# Altium project a0206-2006.PrjPcb (part 1 of 5)
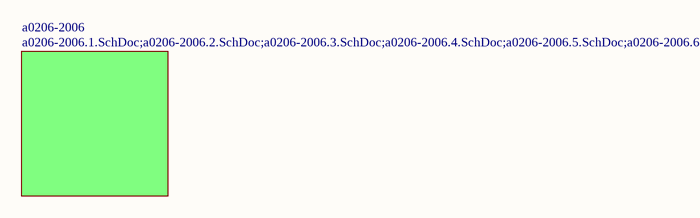
[diagram p0: a0206-2006.SchDoc]
19 sheets, 794 parts. Net scope: flat (ports and power ports of the same name join across sheets).
Sheets:
  a0206-2006.SchDoc
    a0206-2006 = a0206-2006.1.SchDoc
    a0206-2006 = a0206-2006.2.SchDoc
    a0206-2006 = a0206-2006.3.SchDoc
    a0206-2006 = a0206-2006.4.SchDoc
    a0206-2006 = a0206-2006.5.SchDoc
    a0206-2006 = a0206-2006.6.SchDoc
    a0206-2006 = a0206-2006.7.SchDoc
    a0206-2006 = a0206-2006.8.SchDoc
    a0206-2006 = a0206-2006.9.SchDoc
    a0206-2006 = a0206-2006.10.SchDoc
    a0206-2006 = a0206-2006.11.SchDoc
      MXVR265 = mxvr.1.SchDoc
    a0206-2006 = a0206-2006.12.SchDoc
    a0206-2006 = a0206-2006.13.SchDoc
    a0206-2006 = a0206-2006.14.SchDoc
    a0206-2006 = a0206-2006.15.SchDoc
    a0206-2006 = a0206-2006.16.SchDoc
    a0206-2006 = a0206-2006.17.SchDoc

## Sheet a0206-2006.SchDoc
size A

### Sub-sheets
a0206-2006 = a0206-2006.1.SchDoc;a0206-2006.2.SchDoc;a0206-2006.3.SchDoc;a0206-2006.4.SchDoc;a0206-2006.5.SchDoc;a0206-2006.6.SchDoc;a0206-2006.7.SchDoc;a0206-2006.8.SchDoc;a0206-2006.9.SchDoc;a0206-2006.10.SchDoc;a0206-2006.11.SchDoc;a0206-2006.12.SchDoc;a0206-2006.13.SchDoc;a0206-2006.14.SchDoc;a0206-2006.15.SchDoc;a0206-2006.16.SchDoc;a0206-2006.17.SchDoc: no entries

## Sheet a0206-2006.1.SchDoc
size 558 x 431 mm
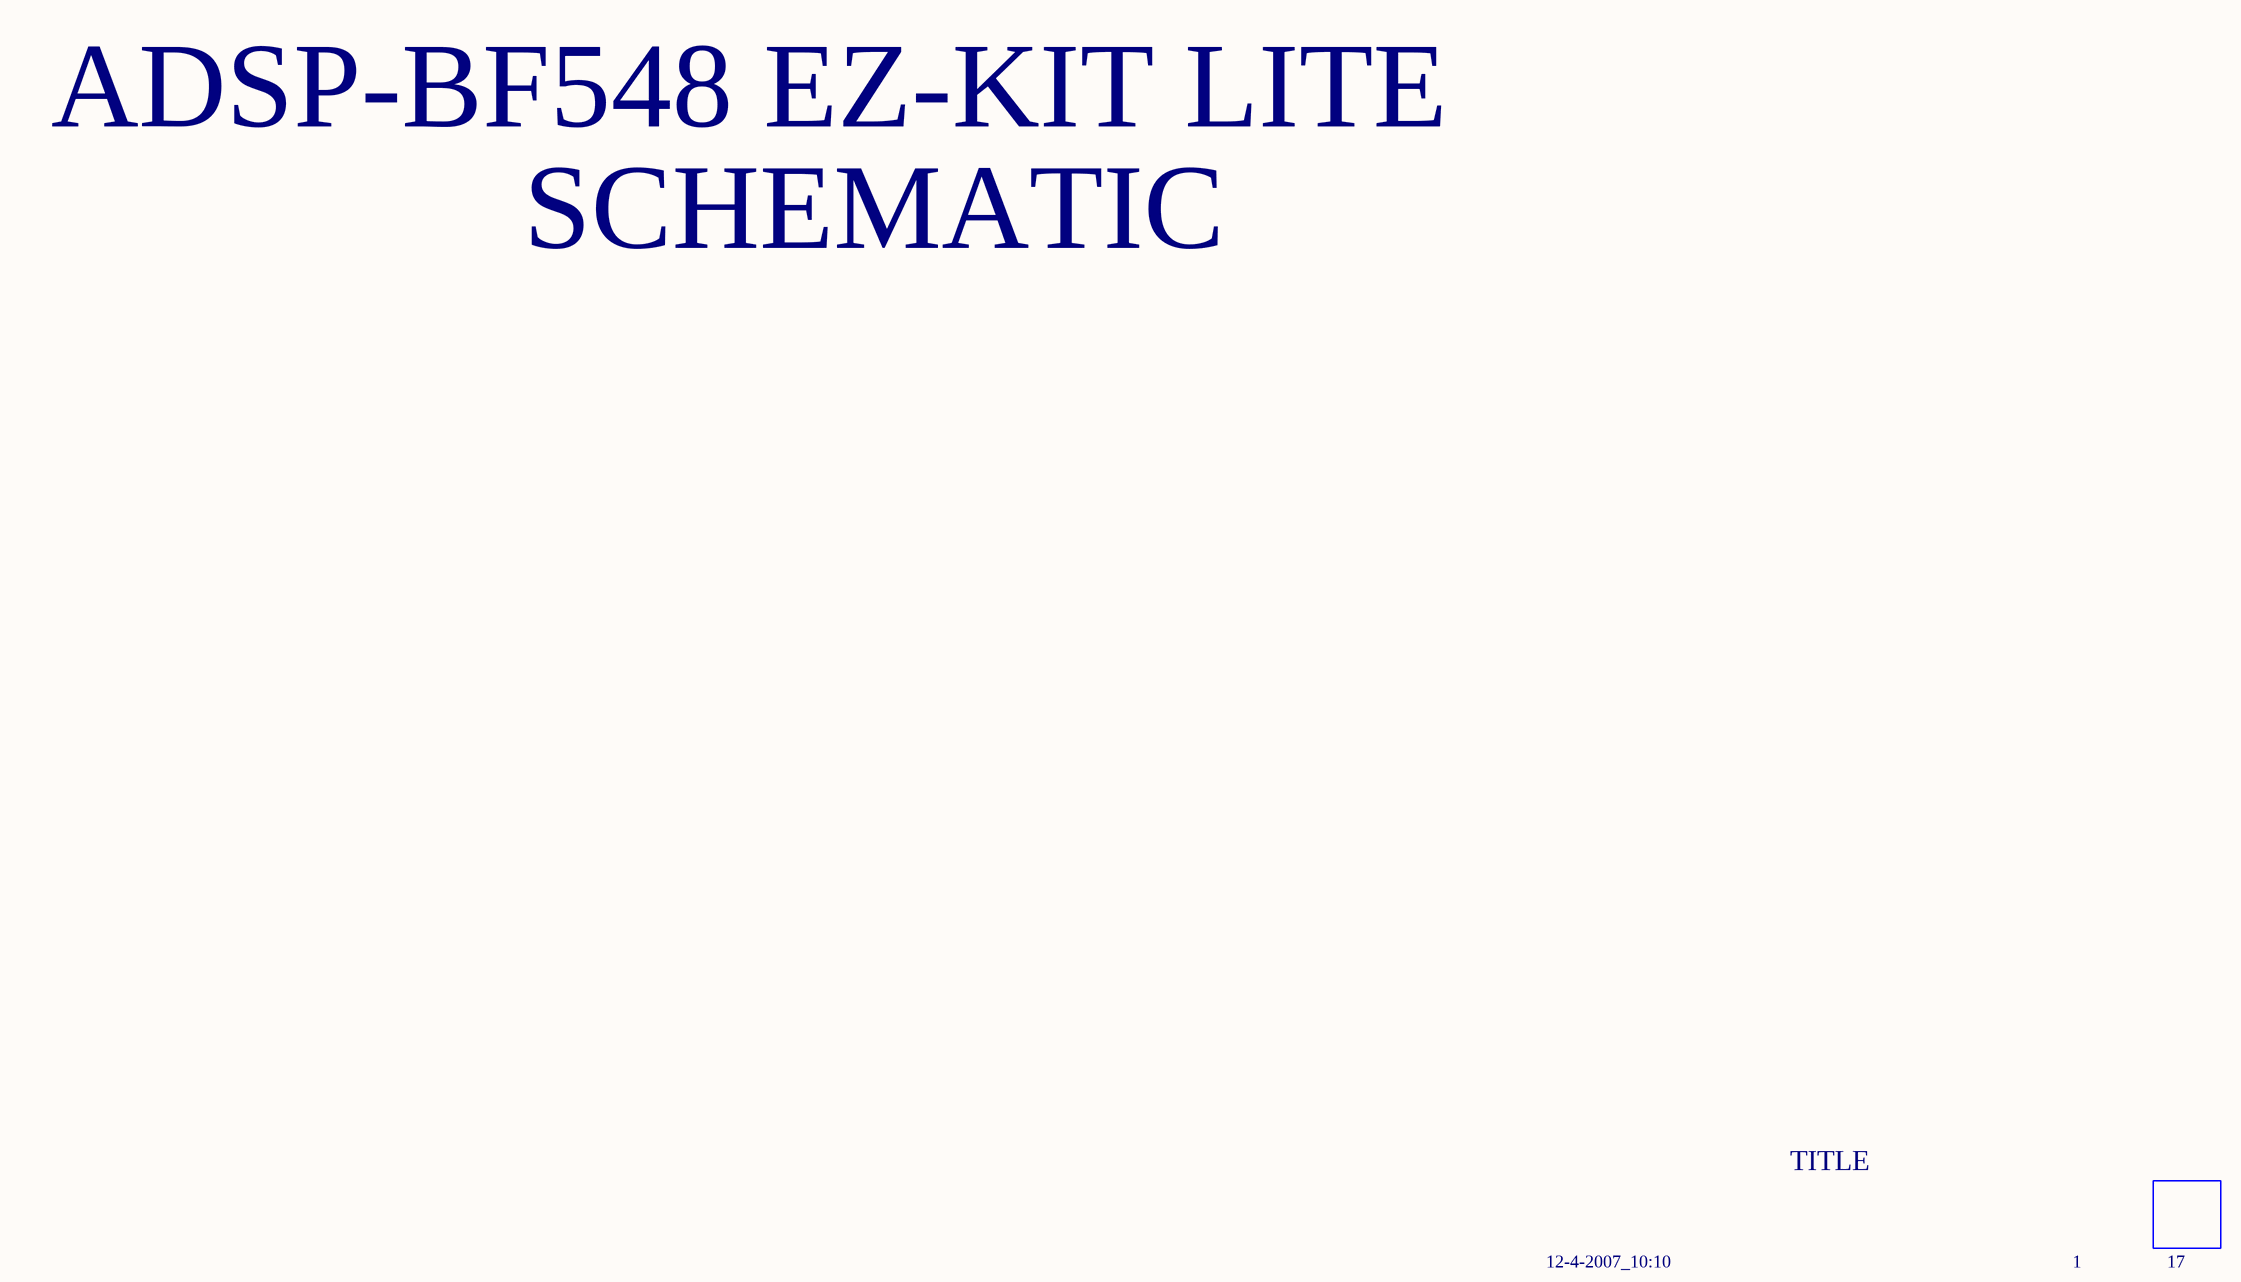
[diagram p1: a0206-2006.1.SchDoc]

### Parts
(Parts that share a designator on the sheet are numbered #1, #2 ... from top to bottom, then left to right.)
*#1  *  (value not drawn)

### Notes on the sheet
- ADSP-BF548 EZ-KIT LITE
- SCHEMATIC
- TITLE
- 12-4-2007_10:10
- (near *#1) 1
- (near *#1) 17
- A
- B
- C
- D
- 2
- 3
- 20 Cotton Road
- 4
- DEVICES
- ANALOG
- Nashua, NH 03063
- PH: 1-800-ANALOGD
- Title
- Size
- Board No.
- A0206-2006
- Rev
- 1.4B
- Date
- Sheet
- of

### Library data of the parts
*#1 = BD_REV.1: CLASS: DNP; LEVEL: BD_REV

## Sheet a0206-2006.2.SchDoc
size 558 x 431 mm
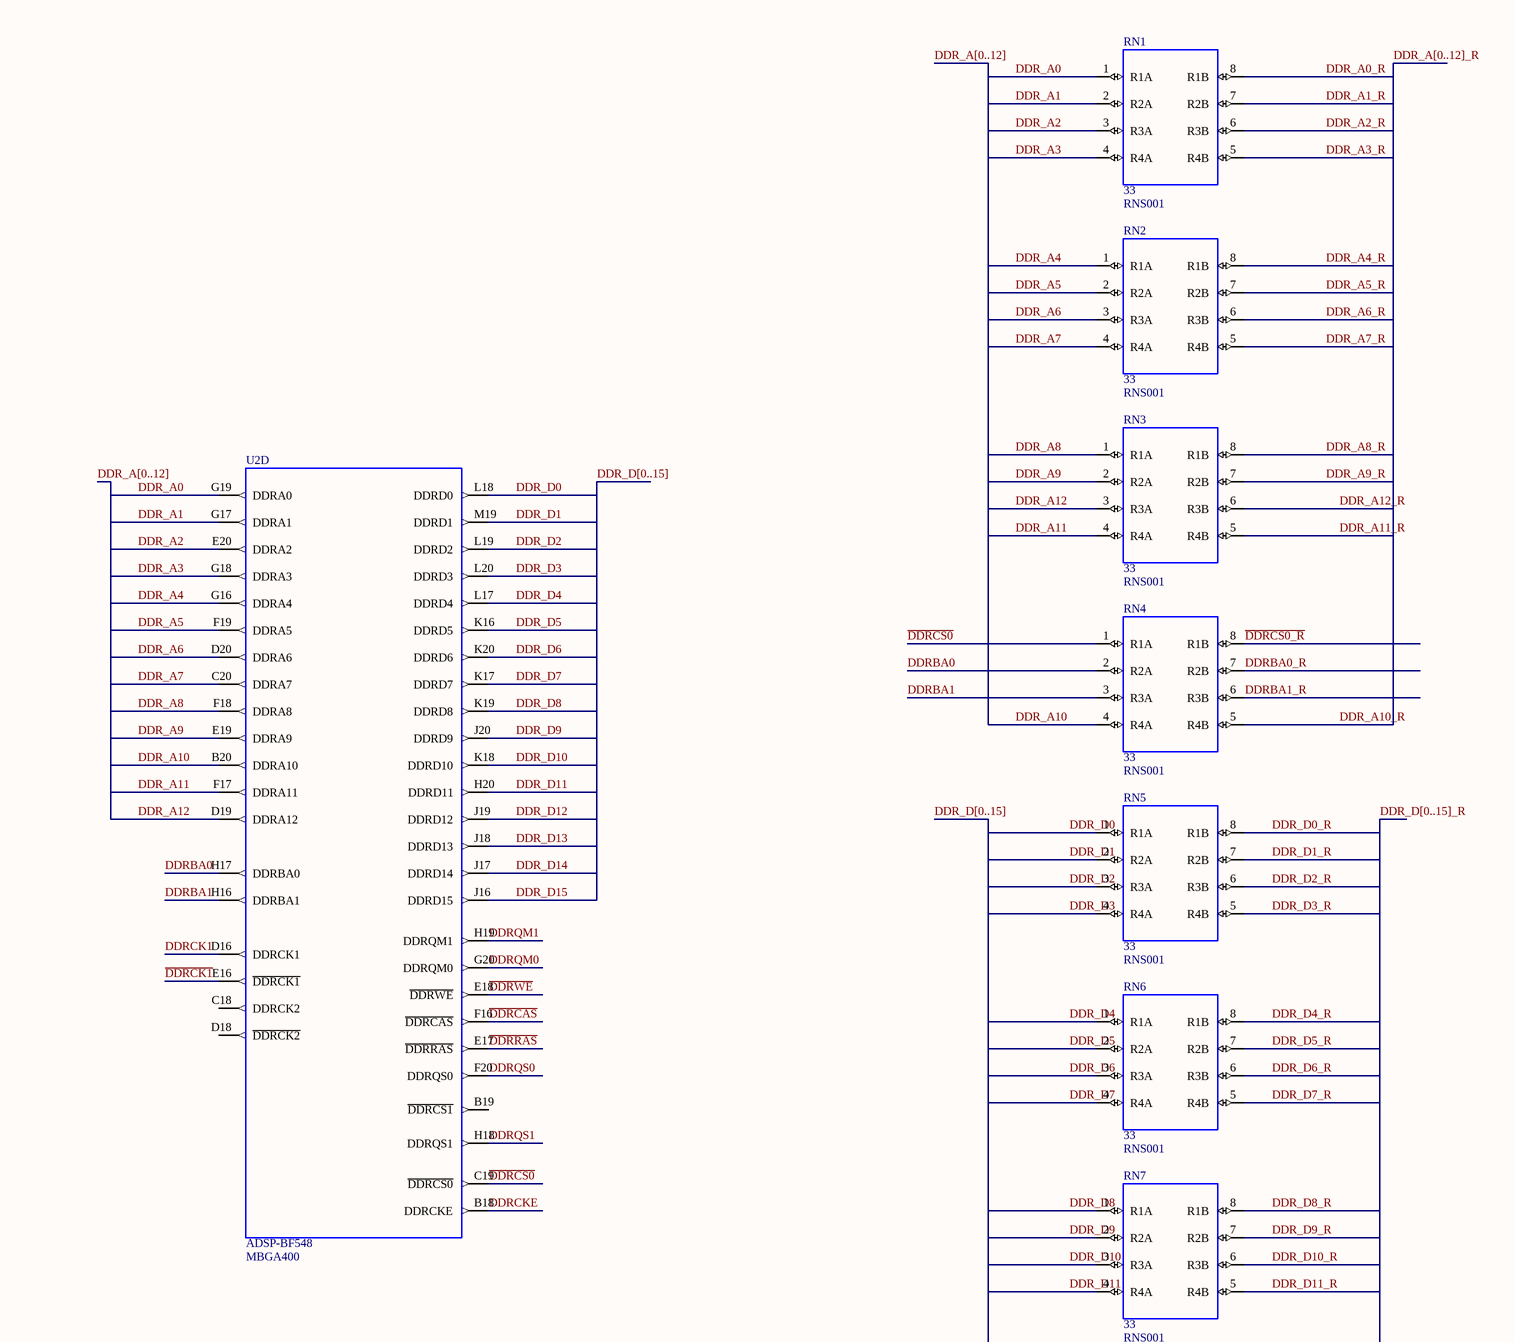
[diagram p2: a0206-2006.2.SchDoc, top left]
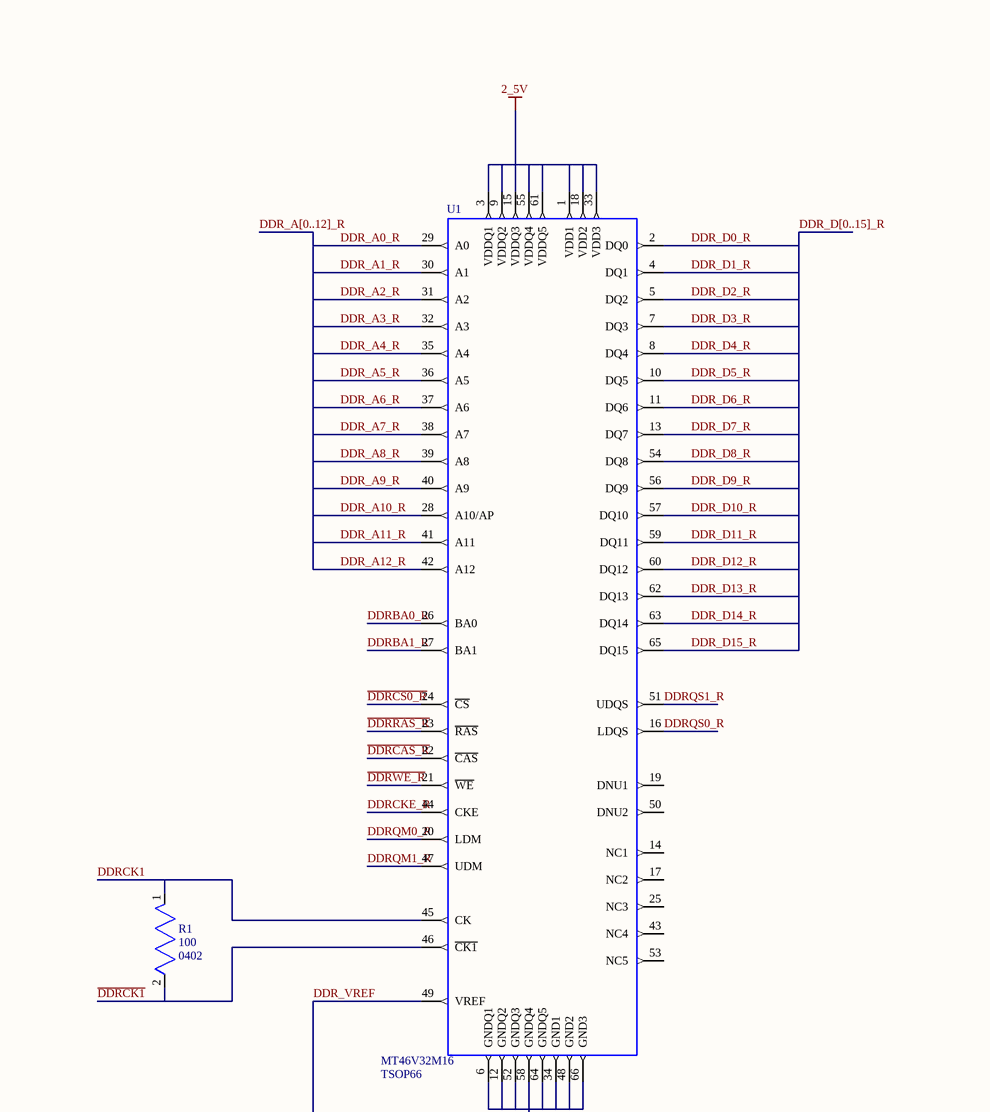
[diagram p3: a0206-2006.2.SchDoc, top right]
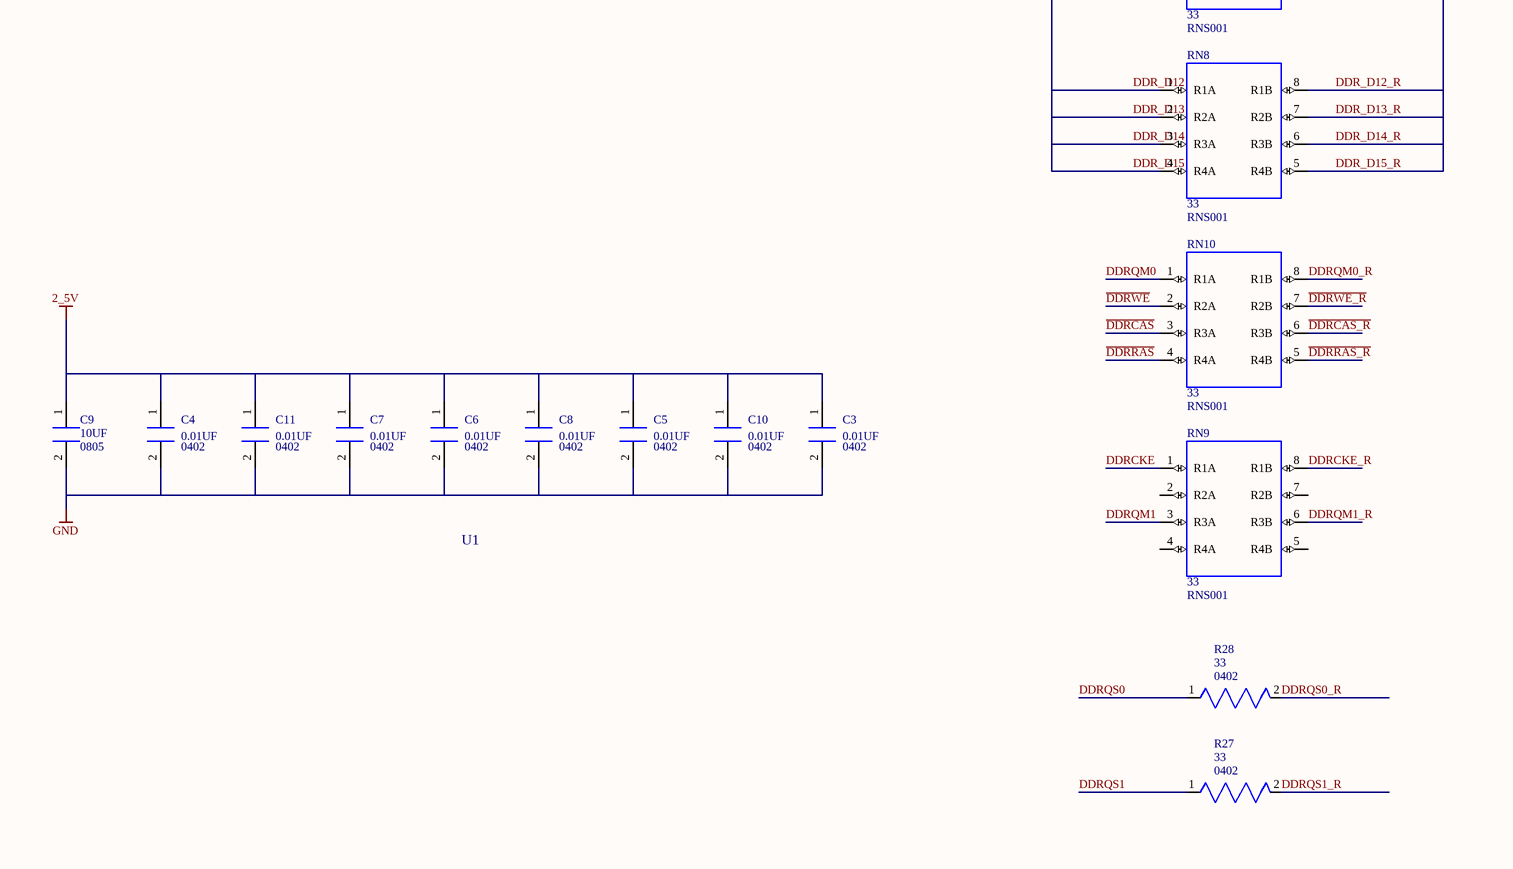
[diagram p4: a0206-2006.2.SchDoc, bottom left]
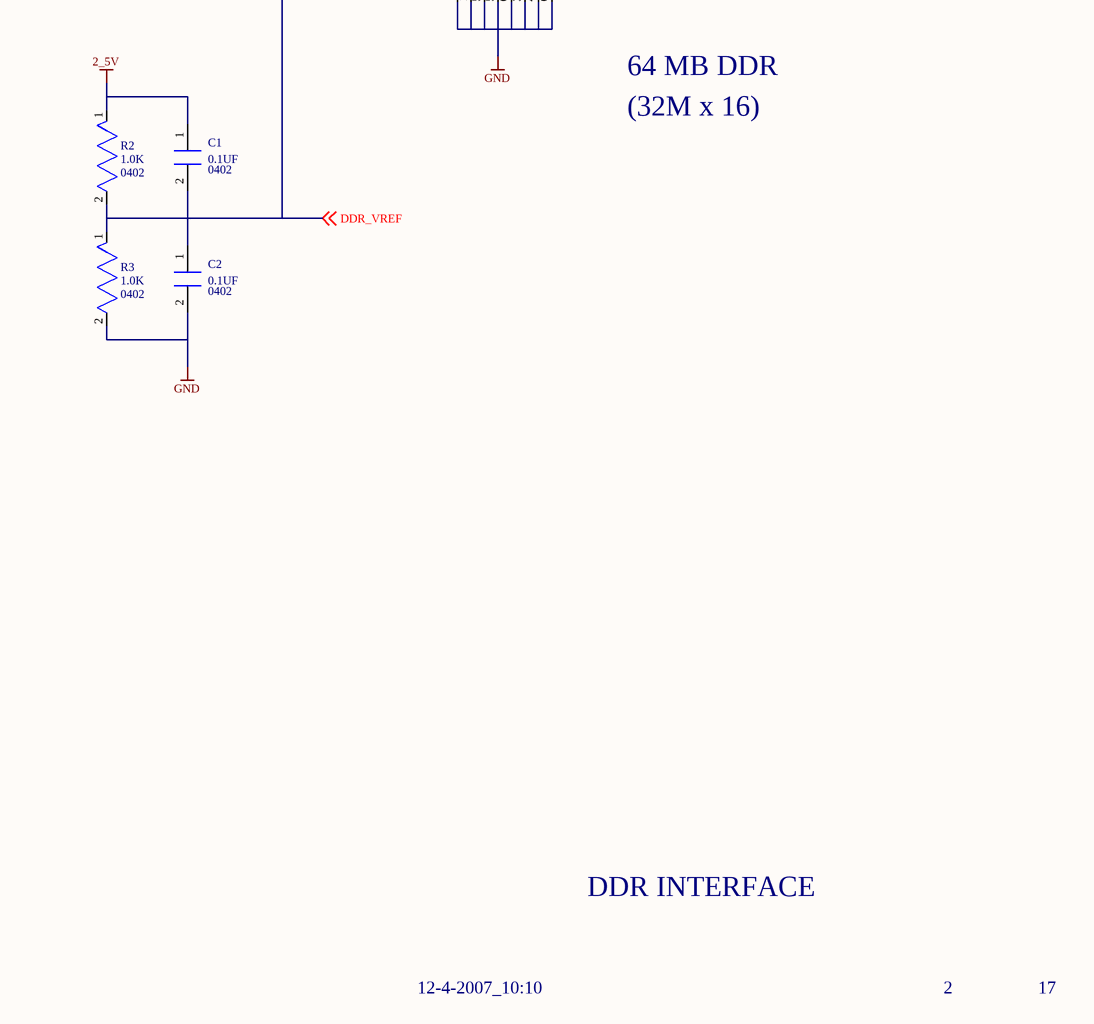
[diagram p5: a0206-2006.2.SchDoc, bottom right]

### Parts
C1  value 0.1UF  [0402]  (hidden comment: *)
C2  value 0.1UF  [0402]  (hidden comment: *)
C3  value 0.01UF  [0402]  (hidden comment: *)
C4  value 0.01UF  [0402]  (hidden comment: *)
C5  value 0.01UF  [0402]  (hidden comment: *)
C6  value 0.01UF  [0402]  (hidden comment: *)
C7  value 0.01UF  [0402]  (hidden comment: *)
C8  value 0.01UF  [0402]  (hidden comment: *)
C9  value 10UF  [0805]  (hidden comment: *)
C10  value 0.01UF  [0402]  (hidden comment: *)
C11  value 0.01UF  [0402]  (hidden comment: *)
R1  value 100  [0402]  (hidden comment: *)
R2  value 1.0K  [0402]  (hidden comment: *)
R3  value 1.0K  [0402]  (hidden comment: *)
R27  value 33  [0402]  (hidden comment: *)
R28  value 33  [0402]  (hidden comment: *)
RN1  value 33  [RNS001]  (hidden comment: *)
RN2  value 33  [RNS001]  (hidden comment: *)
RN3  value 33  [RNS001]  (hidden comment: *)
RN4  value 33  [RNS001]  (hidden comment: *)
RN5  value 33  [RNS001]  (hidden comment: *)
RN6  value 33  [RNS001]  (hidden comment: *)
RN7  value 33  [RNS001]  (hidden comment: *)
RN8  value 33  [RNS001]  (hidden comment: *)
RN9  value 33  [RNS001]  (hidden comment: *)
RN10  value 33  [RNS001]  (hidden comment: *)
U1  PART: MT46V32M16  [TSOP66]  (hidden comment: *)
U2  PART: ADSP-BF548  PKG_TYPE: MBGA400  (hidden comment: ICS_ADSPBF548)  (part D of 7)

### Nets
2_5V: C1.1(A) C3.1(A) C4.1(A) C5.1(A) C6.1(A) C7.1(A) C8.1(A) C9.1(A) C10.1(A) C11.1(A) R2.1(N1) U1.1(VDD1) U1.3(VDDQ1) U1.9(VDDQ2) U1.15(VDDQ3) U1.18(VDD2) U1.33(VDD3) U1.55(VDDQ4) U1.61(VDDQ5)
GND: C2.2(B) C3.2(B) C4.2(B) C5.2(B) C6.2(B) C7.2(B) C8.2(B) C9.2(B) C10.2(B) C11.2(B) R3.2(N2) U1.6(GNDQ1) U1.12(GNDQ2) U1.34(GND1) U1.48(GND2) U1.52(GNDQ3) U1.58(GNDQ4) U1.64(GNDQ5) U1.66(GND3)
~{DDRCAS}: RN10.3(R3A) U2.F16(~{DDRCAS})
~{DDRCAS_R}: RN10.6(R3B) U1.22(~{CAS})
~{DDRCK1}: R1.2(N2) U1.46(~{CK1}) U2.E16(~{DDRCK1})
~{DDRCS0}: RN4.1(R1A) U2.C19(~{DDRCS0})
~{DDRCS0_R}: RN4.8(R1B) U1.24(~{CS})
~{DDRRAS}: RN10.4(R4A) U2.E17(~{DDRRAS})
~{DDRRAS_R}: RN10.5(R4B) U1.23(~{RAS})
~{DDRWE}: RN10.2(R2A) U2.E18(~{DDRWE})
~{DDRWE_R}: RN10.7(R2B) U1.21(~{WE})
DDR_A0: RN1.1(R1A) U2.G19(DDRA0)
DDR_A0_R: RN1.8(R1B) U1.29(A0)
DDR_A1: RN1.2(R2A) U2.G17(DDRA1)
DDR_A1_R: RN1.7(R2B) U1.30(A1)
DDR_A2: RN1.3(R3A) U2.E20(DDRA2)
DDR_A2_R: RN1.6(R3B) U1.31(A2)
DDR_A3: RN1.4(R4A) U2.G18(DDRA3)
DDR_A3_R: RN1.5(R4B) U1.32(A3)
DDR_A4: RN2.1(R1A) U2.G16(DDRA4)
DDR_A4_R: RN2.8(R1B) U1.35(A4)
DDR_A5: RN2.2(R2A) U2.F19(DDRA5)
DDR_A5_R: RN2.7(R2B) U1.36(A5)
DDR_A6: RN2.3(R3A) U2.D20(DDRA6)
DDR_A6_R: RN2.6(R3B) U1.37(A6)
DDR_A7: RN2.4(R4A) U2.C20(DDRA7)
DDR_A7_R: RN2.5(R4B) U1.38(A7)
DDR_A8: RN3.1(R1A) U2.F18(DDRA8)
DDR_A8_R: RN3.8(R1B) U1.39(A8)
DDR_A9: RN3.2(R2A) U2.E19(DDRA9)
DDR_A9_R: RN3.7(R2B) U1.40(A9)
DDR_A10: RN4.4(R4A) U2.B20(DDRA10)
DDR_A10_R: RN4.5(R4B) U1.28(A10/AP)
DDR_A11: RN3.4(R4A) U2.F17(DDRA11)
DDR_A11_R: RN3.5(R4B) U1.41(A11)
DDR_A12: RN3.3(R3A) U2.D19(DDRA12)
DDR_A12_R: RN3.6(R3B) U1.42(A12)
DDR_D0: RN5.1(R1A) U2.L18(DDRD0)
DDR_D0_R: RN5.8(R1B) U1.2(DQ0)
DDR_D1: RN5.2(R2A) U2.M19(DDRD1)
DDR_D1_R: RN5.7(R2B) U1.4(DQ1)
DDR_D2: RN5.3(R3A) U2.L19(DDRD2)
DDR_D2_R: RN5.6(R3B) U1.5(DQ2)
DDR_D3: RN5.4(R4A) U2.L20(DDRD3)
DDR_D3_R: RN5.5(R4B) U1.7(DQ3)
DDR_D4: RN6.1(R1A) U2.L17(DDRD4)
DDR_D4_R: RN6.8(R1B) U1.8(DQ4)
DDR_D5: RN6.2(R2A) U2.K16(DDRD5)
DDR_D5_R: RN6.7(R2B) U1.10(DQ5)
DDR_D6: RN6.3(R3A) U2.K20(DDRD6)
DDR_D6_R: RN6.6(R3B) U1.11(DQ6)
DDR_D7: RN6.4(R4A) U2.K17(DDRD7)
DDR_D7_R: RN6.5(R4B) U1.13(DQ7)
DDR_D8: RN7.1(R1A) U2.K19(DDRD8)
DDR_D8_R: RN7.8(R1B) U1.54(DQ8)
DDR_D9: RN7.2(R2A) U2.J20(DDRD9)
DDR_D9_R: RN7.7(R2B) U1.56(DQ9)
DDR_D10: RN7.3(R3A) U2.K18(DDRD10)
DDR_D10_R: RN7.6(R3B) U1.57(DQ10)
DDR_D11: RN7.4(R4A) U2.H20(DDRD11)
DDR_D11_R: RN7.5(R4B) U1.59(DQ11)
DDR_D12: RN8.1(R1A) U2.J19(DDRD12)
DDR_D12_R: RN8.8(R1B) U1.60(DQ12)
DDR_D13: RN8.2(R2A) U2.J18(DDRD13)
DDR_D13_R: RN8.7(R2B) U1.62(DQ13)
DDR_D14: RN8.3(R3A) U2.J17(DDRD14)
DDR_D14_R: RN8.6(R3B) U1.63(DQ14)
DDR_D15: RN8.4(R4A) U2.J16(DDRD15)
DDR_D15_R: RN8.5(R4B) U1.65(DQ15)
DDR_VREF: C1.2(B) C2.1(A) R2.2(N2) R3.1(N1) U1.49(VREF) ; off-sheet DDR_VREF
DDRBA0: RN4.2(R2A) U2.H17(DDRBA0)
DDRBA0_R: RN4.7(R2B) U1.26(BA0)
DDRBA1: RN4.3(R3A) U2.H16(DDRBA1)
DDRBA1_R: RN4.6(R3B) U1.27(BA1)
DDRCK1: R1.1(N1) U1.45(CK) U2.D16(DDRCK1)
DDRCKE: RN9.1(R1A) U2.B18(DDRCKE)
DDRCKE_R: RN9.8(R1B) U1.44(CKE)
DDRQM0: RN10.1(R1A) U2.G20(DDRQM0)
DDRQM0_R: RN10.8(R1B) U1.20(LDM)
DDRQM1: RN9.3(R3A) U2.H19(DDRQM1)
DDRQM1_R: RN9.6(R3B) U1.47(UDM)
DDRQS0: R28.1(N1) U2.F20(DDRQS0)
DDRQS0_R: R28.2(N2) U1.16(LDQS)
DDRQS1: R27.1(N1) U2.H18(DDRQS1)
DDRQS1_R: R27.2(N2) U1.51(UDQS)

Not connected (* = marked no-connect by the designer): RN9 2(R2A) 4(R4A) 5(R4B) 7(R2B); U1 14(NC1) 17(NC2) 19(DNU1) 25(NC3) 43(NC4) 50(DNU2) 53(NC5); U2 B19(~{DDRCS1}) C18(DDRCK2) D18(~{DDRCK2})

### Buses and harness runs
bus DDR_A[0..12]
bus DDR_A[0..12]_R
bus DDR_D[0..15]
bus DDR_D[0..15]_R

### Notes on the sheet
- 64 MB DDR
- (32M x 16)
- U1
- DDR INTERFACE
- 12-4-2007_10:10
- 2
- 17
- A
- B
- C
- D
- 1
- 3
- 20 Cotton Road
- 4
- DEVICES
- ANALOG
- Nashua, NH 03063
- PH: 1-800-ANALOGD
- Title
- ADSP-BF548 EZ-KIT LITE
- Size
- Board No.
- A0206-2006
- Rev
- 1.4B
- Date
- Sheet
- of

### Library data of the parts
C1 = CAP_NON_POLARIZED.2: PART_SPEC: CAPACITOR; LEVEL: STD; TOLERANCE: 10%; VOLTAGE: 10V; TYPE: X5R; PRT_NUM: 7000278; PKG_TYPE: 0402; ROHS: ROHS
C2 = CAP_NON_POLARIZED.2: PART_SPEC: CAPACITOR; LEVEL: STD; PRT_NUM: 7000278; TYPE: X5R; VOLTAGE: 10V; TOLERANCE: 10%; PKG_TYPE: 0402; ROHS: ROHS
C3 C4 = CAP_NON_POLARIZED.2: PART_SPEC: CAPACITOR; LEVEL: STD; PRT_NUM: 7000279; VOLTAGE: 16V; TOLERANCE: 10%; BOARDS: BOTH; TYPE: X7R; PKG_TYPE: 0402; ROHS: ROHS
C5 C6 = CAP_NON_POLARIZED.2: PART_SPEC: CAPACITOR; LEVEL: STD; TYPE: X7R; BOARDS: BOTH; PRT_NUM: 7000279; VOLTAGE: 16V; TOLERANCE: 10%; PKG_TYPE: 0402; ROHS: ROHS
C7 C8 C10 C11 = CAP_NON_POLARIZED.2: PART_SPEC: CAPACITOR; LEVEL: STD; TYPE: X7R; BOARDS: BOTH; TOLERANCE: 10%; VOLTAGE: 16V; PRT_NUM: 7000279; PKG_TYPE: 0402; ROHS: ROHS
C9 = CAP_NON_POLARIZED.2: PART_SPEC: CAPACITOR; LEVEL: STD; TYPE: X5R; PRT_NUM: 7000265; VOLTAGE: 6.3V; TOLERANCE: 10%; BOARDS: BOTH; PKG_TYPE: 0805; ROHS: ROHS
R1 = RES_STANDARD.2: PART_SPEC: RESISTOR; LEVEL: STD; BOARDS: BOTH; PRT_NUM: 7000432; TOLERANCE: 5%; POWER: 1/16W; PKG_TYPE: 0402; ROHS: ROHS
R2 = RES_STANDARD.2: PART_SPEC: RESISTOR; LEVEL: STD; PRT_NUM: 7000571; TOLERANCE: 1%; POWER: 1/16W; PKG_TYPE: 0402; ROHS: ROHS
R3 = RES_STANDARD.2: PART_SPEC: RESISTOR; LEVEL: STD; PRT_NUM: 7000571; POWER: 1/16W; TOLERANCE: 1%; PKG_TYPE: 0402; ROHS: ROHS
R27 = RES_STANDARD.1: PART_SPEC: RESISTOR; LEVEL: STD; PRT_NUM: 7000285; POWER: 1/16W; TOLERANCE: 5%; PKG_TYPE: 0402; ROHS: ROHS
R28 = RES_STANDARD.1: PART_SPEC: RESISTOR; LEVEL: STD; TOLERANCE: 5%; POWER: 1/16W; PRT_NUM: 7000285; PKG_TYPE: 0402; ROHS: ROHS
RN1 RN3 RN6 RN8 RN10 = RNET_4SERIES.1: SERIES; PART_SPEC: RESISTOR_NETWORK; LEVEL: STD; PRT_NUM: 7000558; TOLERANCE: 5%; POWER: 125MW; PKG_TYPE: RNS001; ROHS: ROHS
RN2 RN4 RN5 RN7 RN9 = RNET_4SERIES.1: SERIES; PART_SPEC: RESISTOR_NETWORK; LEVEL: STD; PRT_NUM: 7000558; POWER: 125MW; TOLERANCE: 5%; PKG_TYPE: RNS001; ROHS: ROHS
U1 = ICS_MT46V32M16.1: 8MX16X4 DDR SDRAM; LEVEL: STD; PRT_NUM: 1000423; PKG_TYPE: TSOP66; WEB: http://www.micron.com/products/partdetail?part; ROHS: ROHS
U2 = ICS_ADSPBF548_A: 600 MHZ; LEVEL: STD; PRT_NUM: 30-025548-02; DEVICE: ICS_ADSPBF548; ROHS: ROHS; WEB: http://www.analog.com/en/prod/0,2877,ADSP%252DBF548,00.html

## Sheet a0206-2006.3.SchDoc
size 558 x 431 mm
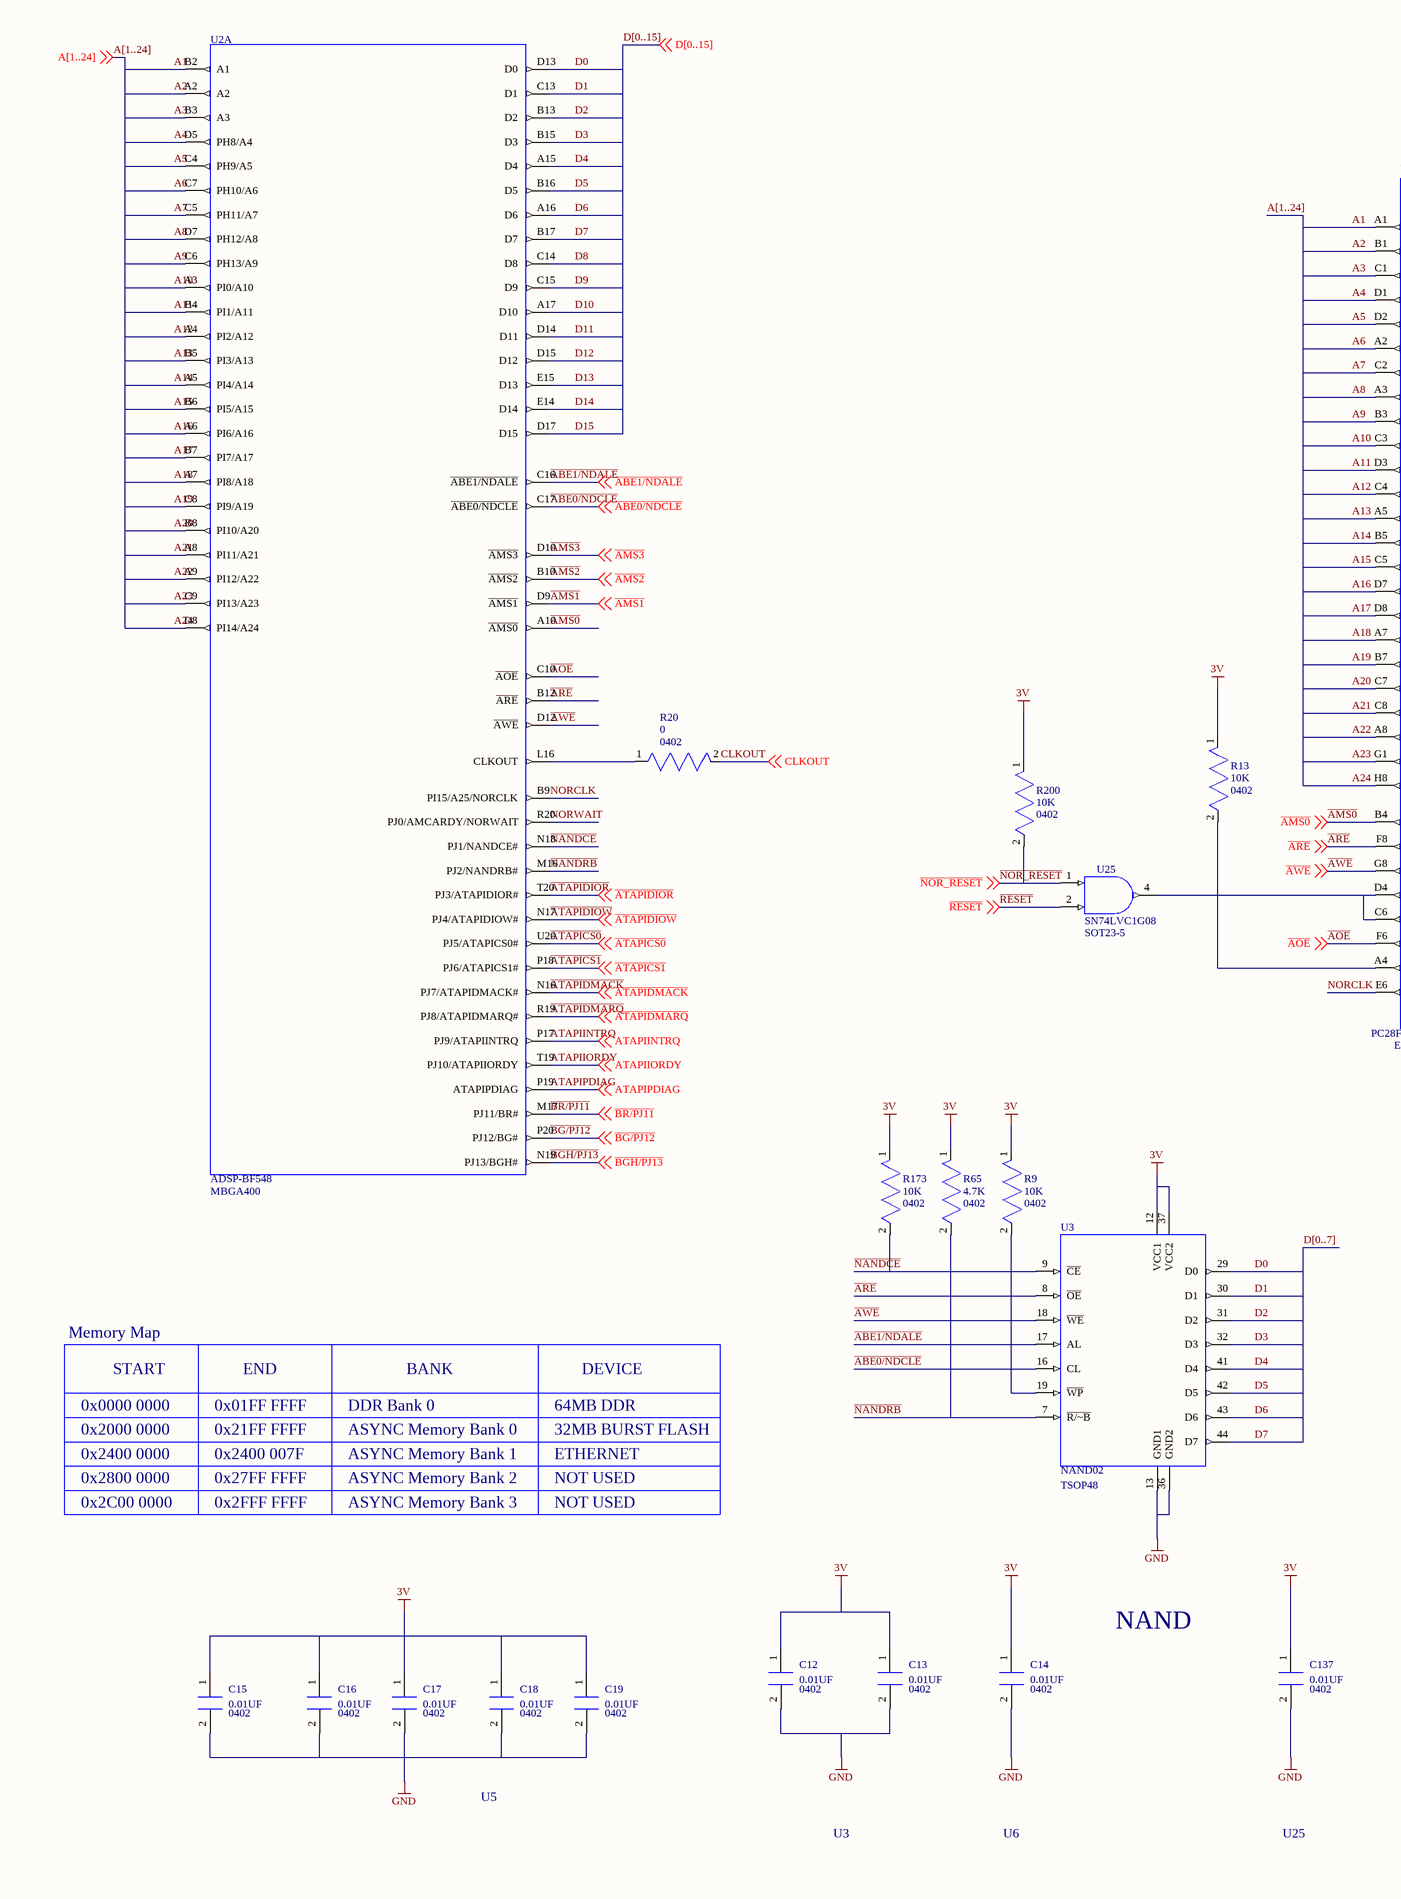
[diagram p6: a0206-2006.3.SchDoc, left]
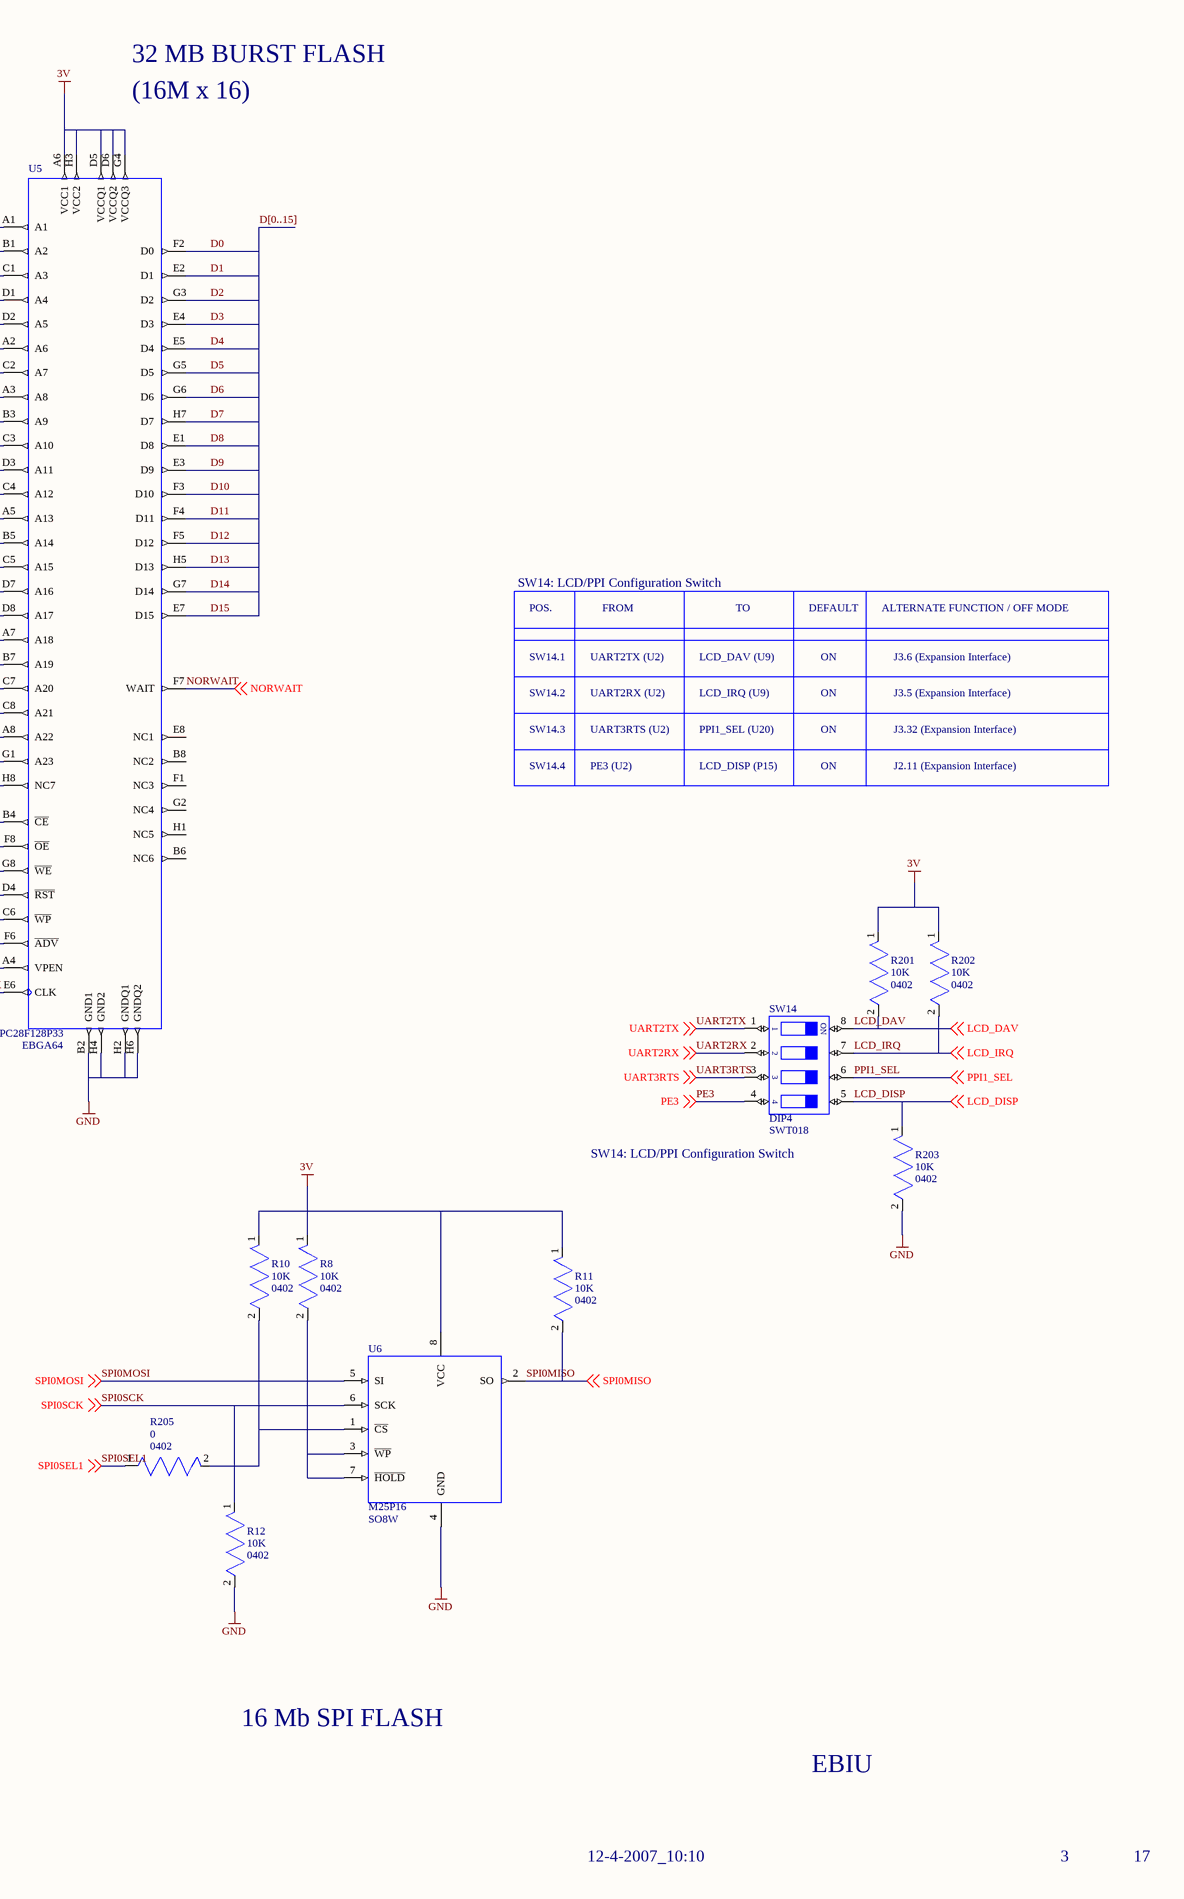
[diagram p7: a0206-2006.3.SchDoc, right]

### Parts
C12  value 0.01UF  [0402]  (hidden comment: *)
C13  value 0.01UF  [0402]  (hidden comment: *)
C14  value 0.01UF  [0402]  (hidden comment: *)
C15  value 0.01UF  [0402]  (hidden comment: *)
C16  value 0.01UF  [0402]  (hidden comment: *)
C17  value 0.01UF  [0402]  (hidden comment: *)
C18  value 0.01UF  [0402]  (hidden comment: *)
C19  value 0.01UF  [0402]  (hidden comment: *)
C137  value 0.01UF  [0402]  (hidden comment: *)
R8  value 10K  [0402]  (hidden comment: *)
R9  value 10K  [0402]  (hidden comment: *)
R10  value 10K  [0402]  (hidden comment: *)
R11  value 10K  [0402]  (hidden comment: *)
R12  value 10K  [0402]  (hidden comment: *)
R13  value 10K  [0402]  (hidden comment: *)
R20  value 0  [0402]  (hidden comment: *)
R65  value 4.7K  [0402]  (hidden comment: *)
R173  value 10K  [0402]  (hidden comment: *)
R200  value 10K  [0402]  (hidden comment: *)
R201  value 10K  [0402]  (hidden comment: *)
R202  value 10K  [0402]  (hidden comment: *)
R203  value 10K  [0402]  (hidden comment: *)
R205  value 0  [0402]  (hidden comment: *)
SW14  value DIP4  [SWT018]  (hidden comment: *)
U2  PART: ADSP-BF548  PKG_TYPE: MBGA400  (hidden comment: ICS_ADSPBF548)  (part A of 7)
U3  PART: NAND02  [TSOP48]  (hidden comment: *)
U5  PART: PC28F128P33  [EBGA64]  (hidden comment: *)
U6  PART: M25P16  [SO8W]  (hidden comment: *)
U25  PART: SN74LVC1G08  [SOT23-5]  (hidden comment: *)

### Nets
3V: C12.1(A) C13.1(A) C14.1(A) C15.1(A) C16.1(A) C17.1(A) C18.1(A) C19.1(A) C137.1(A) R8.1(N1) R9.1(N1) R10.1(N1) R11.1(N1) R13.1(N1) R65.1(N1) R173.1(N1) R200.1(N1) R201.1(N1) R202.1(N1) U3.12(VCC1) U3.37(VCC2) U5.A6(VCC1) U5.D5(VCCQ1) U5.D6(VCCQ2) U5.G4(VCCQ3) U5.H3(VCC2) U6.8(VCC) U25.5(3V)
GND: C12.2(B) C13.2(B) C14.2(B) C15.2(B) C16.2(B) C17.2(B) C18.2(B) C19.2(B) C137.2(B) R12.2(N2) R203.2(N2) U3.13(GND1) U3.36(GND2) U5.B2(GND1) U5.H2(GNDQ1) U5.H4(GND2) U5.H6(GNDQ2) U6.4(GND) U25.3(GND)
A1: U2.B2(A1) U5.A1
A2: U2.A2 U5.B1(A2)
A3: U2.B3(A3) U5.C1(A3)
A4: U2.D5(PH8/A4) U5.D1(A4)
A5: U2.C4(PH9/A5) U5.D2(A5)
A6: U2.C7(PH10/A6) U5.A2(A6)
A7: U2.C5(PH11/A7) U5.C2(A7)
A8: U2.D7(PH12/A8) U5.A3(A8)
A9: U2.C6(PH13/A9) U5.B3(A9)
A10: U2.A3(PI0/A10) U5.C3(A10)
A11: U2.B4(PI1/A11) U5.D3(A11)
A12: U2.A4(PI2/A12) U5.C4(A12)
A13: U2.B5(PI3/A13) U5.A5(A13)
A14: U2.A5(PI4/A14) U5.B5(A14)
A15: U2.B6(PI5/A15) U5.C5(A15)
A16: U2.A6(PI6/A16) U5.D7(A16)
A17: U2.B7(PI7/A17) U5.D8(A17)
A18: U2.A7(PI8/A18) U5.A7(A18)
A19: U2.C8(PI9/A19) U5.B7(A19)
A20: U2.B8(PI10/A20) U5.C7(A20)
A21: U2.A8(PI11/A21) U5.C8(A21)
A22: U2.A9(PI12/A22) U5.A8(A22)
A23: U2.C9(PI13/A23) U5.G1(A23)
A24: U2.D8(PI14/A24) U5.H8(NC7)
~{ABE0/NDCLE}: U2.C17(~{ABE0/NDCLE}) U3.16(CL) ; off-sheet ~{ABE0/NDCLE}
~{ABE1/NDALE}: U2.C16(~{ABE1/NDALE}) U3.17(AL) ; off-sheet ~{ABE1/NDALE}
~{AMS0}: U2.A10(~{AMS0}) U5.B4(~{CE}) ; off-sheet ~{AMS0}
~{AMS1}: U2.D9(~{AMS1}) ; off-sheet ~{AMS1}
~{AMS2}: U2.B10(~{AMS2}) ; off-sheet ~{AMS2}
~{AMS3}: U2.D10(~{AMS3}) ; off-sheet ~{AMS3}
~{AOE}: U2.C10(~{AOE}) U5.F6(~{ADV}) ; off-sheet ~{AOE}
~{ARE}: U2.B12(~{ARE}) U3.8(~{OE}) U5.F8(~{OE}) ; off-sheet ~{ARE}
~{ATAPICS0}: U2.U20(PJ5/ATAPICS0#) ; off-sheet ~{ATAPICS0}
~{ATAPICS1}: U2.P18(PJ6/ATAPICS1#) ; off-sheet ~{ATAPICS1}
~{ATAPIDIOR}: U2.T20(PJ3/ATAPIDIOR#) ; off-sheet ~{ATAPIDIOR}
~{ATAPIDIOW}: U2.N17(PJ4/ATAPIDIOW#) ; off-sheet ~{ATAPIDIOW}
~{ATAPIDMACK}: U2.N16(PJ7/ATAPIDMACK#) ; off-sheet ~{ATAPIDMACK}
~{ATAPIDMARQ}: U2.R19(PJ8/ATAPIDMARQ#) ; off-sheet ~{ATAPIDMARQ}
~{AWE}: U2.D12(~{AWE}) U3.18(~{WE}) U5.G8(~{WE}) ; off-sheet ~{AWE}
ATAPIINTRQ: U2.P17(PJ9/ATAPIINTRQ) ; off-sheet ATAPIINTRQ
ATAPIIORDY: U2.T19(PJ10/ATAPIIORDY) ; off-sheet ATAPIIORDY
ATAPIPDIAG: U2.P19(ATAPIPDIAG) ; off-sheet ATAPIPDIAG
~{BG/PJ12}: U2.P20(PJ12/BG#) ; off-sheet ~{BG/PJ12}
~{BGH/PJ13}: U2.N19(PJ13/BGH#) ; off-sheet ~{BGH/PJ13}
~{BR/PJ11}: U2.M17(PJ11/BR#) ; off-sheet ~{BR/PJ11}
CLKOUT: R20.2(N2) ; off-sheet CLKOUT
D0: U2.D13(D0) U3.29(D0) U5.F2(D0)
D1: U2.C13(D1) U3.30(D1) U5.E2(D1)
D2: U2.B13(D2) U3.31(D2) U5.G3(D2)
D3: U2.B15(D3) U3.32(D3) U5.E4(D3)
D4: U2.A15(D4) U3.41(D4) U5.E5(D4)
D5: U2.B16(D5) U3.42(D5) U5.G5(D5)
D6: U2.A16(D6) U3.43(D6) U5.G6(D6)
D7: U2.B17(D7) U3.44(D7) U5.H7(D7)
D8: U2.C14(D8) U5.E1(D8)
D9: U2.C15(D9) U5.E3(D9)
D10: U2.A17(D10) U5.F3(D10)
D11: U2.D14(D11) U5.F4(D11)
D12: U2.D15(D12) U5.F5(D12)
D13: U2.E15(D13) U5.H5(D13)
D14: U2.E14(D14) U5.G7(D14)
D15: U2.D17(D15) U5.E7(D15)
LCD_DAV: R201.2(N2) SW14.8 ; off-sheet LCD_DAV
LCD_DISP: R203.1(N1) SW14.5 ; off-sheet LCD_DISP
LCD_IRQ: R202.2(N2) SW14.7 ; off-sheet LCD_IRQ
~{NANDCE}: R173.2(N2) U2.N18(PJ1/NANDCE#) U3.9(~{CE})
~{NANDRB}: R65.2(N2) U2.M16(PJ2/NANDRB#) U3.7(~{R/~B})
~{NOR_RESET}: R200.2(N2) U25.1(A) ; off-sheet ~{NOR_RESET}
NORCLK: U2.B9(PI15/A25/NORCLK) U5.E6(CLK)
NORWAIT: U2.R20(PJ0/AMCARDY/NORWAIT) U5.F7(WAIT) ; off-sheet NORWAIT
PE3: SW14.4 ; off-sheet PE3
PPI1_SEL: SW14.6 ; off-sheet PPI1_SEL
~{RESET}: U25.2(B) ; off-sheet ~{RESET}
SPI0MISO: R11.2(N2) U6.2(SO) ; off-sheet SPI0MISO
SPI0MOSI: U6.5(SI) ; off-sheet SPI0MOSI
SPI0SCK: R12.1(N1) U6.6(SCK) ; off-sheet SPI0SCK
SPI0SEL1: R205.1(N1) ; off-sheet SPI0SEL1
UART2RX: SW14.2 ; off-sheet UART2RX
UART2TX: SW14.1 ; off-sheet UART2TX
UART3RTS: SW14.3 ; off-sheet UART3RTS
NetR8_2: R8.2(N2) U6.3(~{WP}) U6.7(~{HOLD})
NetR9_2: R9.2(N2) U3.19(~{WP})
NetR10_2: R10.2(N2) R205.2(N2) U6.1(~{CS})
NetR13_2: R13.2(N2) U5.A4(VPEN)
NetR20_1: R20.1(N1) U2.L16(CLKOUT)
NetU5_C6: U5.C6(~{WP}) U5.D4(~{RST}) U25.4(Y)

Not connected (* = marked no-connect by the designer): U3 1 2 3 4 5 6 10 11 14 15 20 21 22 23 24 25 26 27 28 33 34 35 38 39 40 45 46 47 48; U5 B6(NC6) B8(NC2) E8(NC1) F1(NC3) G2(NC4) H1(NC5)

### Buses and harness runs
bus A[1..24]
bus D[0..7]
bus D[0..15]

### Notes on the sheet
- (16M x 16)
- 32 MB BURST FLASH
- SW14: LCD/PPI Configuration Switch
- SW14.1
- POS.
- UART2TX (U2)
- FROM
- LCD_DAV (U9)
- TO
- DEFAULT
- ON
- ALTERNATE FUNCTION / OFF MODE
- J3.6 (Expansion Interface)
- SW14.2
- UART2RX (U2)
- LCD_IRQ (U9)
- J3.5 (Expansion Interface)
- SW14.3
- SW14.4
- PE3 (U2)
- UART3RTS (U2)
- PPI1_SEL (U20)
- LCD_DISP (P15)
- J2.11 (Expansion Interface)
- J3.32 (Expansion Interface)
- (near SW14) SW14: LCD/PPI Configuration Switch
- Memory Map
- START
- END
- BANK
- DEVICE
- 0x0000 0000
- 0x2000 0000
- 0x2400 0000
- 0x01FF FFFF
- 0x21FF FFFF
- 0x2400 007F
- ASYNC Memory Bank 0
- ASYNC Memory Bank 1
- DDR Bank 0
- 64MB DDR
- 32MB BURST FLASH
- ETHERNET
- 0x2800 0000
- 0x2C00 0000
- 0x27FF FFFF
- 0x2FFF FFFF
- ASYNC Memory Bank 2
- ASYNC Memory Bank 3
- NOT USED
- NAND
- 16 Mb SPI FLASH
- U5
- EBIU
- U3
- U6
- U25
- 12-4-2007_10:10
- 3
- 17
- A
- B
- C
- D
- 1
- 2
- 20 Cotton Road
- 4
- DEVICES
- ANALOG
- Nashua, NH 03063
- PH: 1-800-ANALOGD
- Title
- ADSP-BF548 EZ-KIT LITE
- Size
- Board No.
- A0206-2006
- Rev
- 1.4B
- Date
- Sheet
- of
- (in symbol SW_DIP4.1) ON

### Library data of the parts
C12 C14 C16 C18 = CAP_NON_POLARIZED.2: as C5 on sheet a0206-2006.2; PKG_TYPE: 0402; ROHS: ROHS
C13 C15 C17 C19 C137 = CAP_NON_POLARIZED.2: PART_SPEC: CAPACITOR; LEVEL: STD; TOLERANCE: 10%; VOLTAGE: 16V; PRT_NUM: 7000279; BOARDS: BOTH; TYPE: X7R; PKG_TYPE: 0402; ROHS: ROHS
R8 R12 R200 R201 = RES_STANDARD.2: PART_SPEC: RESISTOR; LEVEL: STD; PRT_NUM: 7000280; TOLERANCE: 5%; BOARDS: BOTH; POWER: 1/16W; PKG_TYPE: 0402; ROHS: ROHS
R9-R11 R13 R173 R202 R203 = RES_STANDARD.2: PART_SPEC: RESISTOR; LEVEL: STD; POWER: 1/16W; BOARDS: BOTH; TOLERANCE: 5%; PRT_NUM: 7000280; PKG_TYPE: 0402; ROHS: ROHS
R20 = RES_STANDARD.1: PART_SPEC: RESISTOR; LEVEL: STD; PRT_NUM: 7000282; POWER: 1/16W; TOLERANCE: 5%; PKG_TYPE: 0402; ROHS: ROHS
R65 = RES_STANDARD.2: PART_SPEC: RESISTOR; LEVEL: STD; PRT_NUM: 7000281; TOLERANCE: 5%; BOARDS: BOTH; POWER: 1/16W; PKG_TYPE: 0402; ROHS: ROHS
R205 = RES_STANDARD.1: PART_SPEC: RESISTOR; LEVEL: STD; TOLERANCE: 5%; POWER: 1/16W; PRT_NUM: 7000282; PKG_TYPE: 0402; ROHS: ROHS
SW14 = SW_DIP4.1: PART_SPEC: SWITCH; LEVEL: STD; PRT_NUM: 6000144; PKG_TYPE: SWT018; ROHS: ROHS
U2 = ICS_ADSPBF548_A: as U2 on sheet a0206-2006.2; DEVICE: ICS_ADSPBF548; ROHS: ROHS; WEB: http://www.analog.com/en/prod/0,2877,ADSP%252DBF548,00.html
U3 = ICS_NAND02.1: 2GBIT_NAND_FLASH; NC: 1,2,3,4,5,6,10,11,14,15,20,21,22,23,24,25,26,27,28,33,34,35,38,39,40,45,46,47,48; LEVEL: STD; PRT_NUM: 1000354; PKG_TYPE: TSOP48; ROHS: ROHS; WEB: http://www.st.com/stonline/stappl/productcatalog/app?path
U5 = PRG_PC28F128P33.1: 16MX16-FLASH; ICS_BASE_PART: 1000424; LEVEL: STD; BD_REFDES: "U5"; BOARD: BF548; PRT_NUM: 1000427; PKG_TYPE: EBGA64; WEB: http://www.intel.com/design/flcomp/datashts/314749.htm; ROHS: ROHS
U6 = PRG_M25P80.1: 16MBIT 3V SERIAL SPI ROM; ICS_BASE_PART: 1000418; LEVEL: STD; BOARD: BF548; BD_REFDES: “U6”; PRT_NUM: 1000445; PKG_TYPE: SO8W; WEB: http://www.st.com/stonline/products/literature/ds/10027/m25p16.htm; ROHS: ROHS
U25 = ICS_SN74XXX1G08.1: SINGLE 2-INPUT AND; LEVEL: STD; PRT_NUM: 1000287; BOARDS: BOTH; PKG_TYPE: SOT23-5; WEB: http://focus.ti.com/docs/prod/folders/print/sn74lvc1g08.html; ROHS: ROHS

## Sheet a0206-2006.4.SchDoc
size 558 x 431 mm
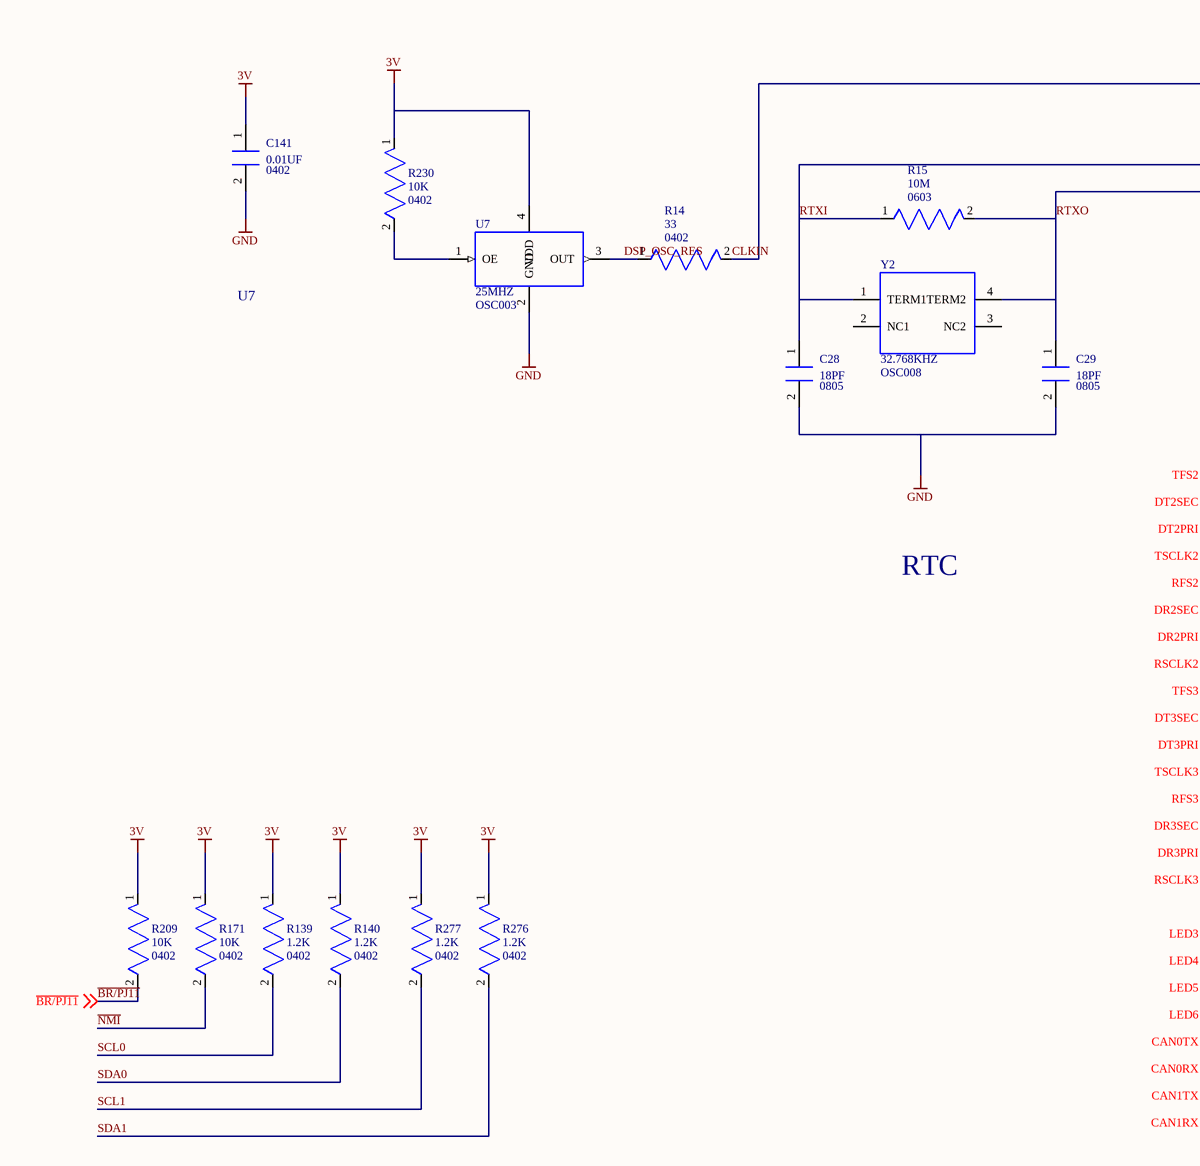
[diagram p8: a0206-2006.4.SchDoc, top left]
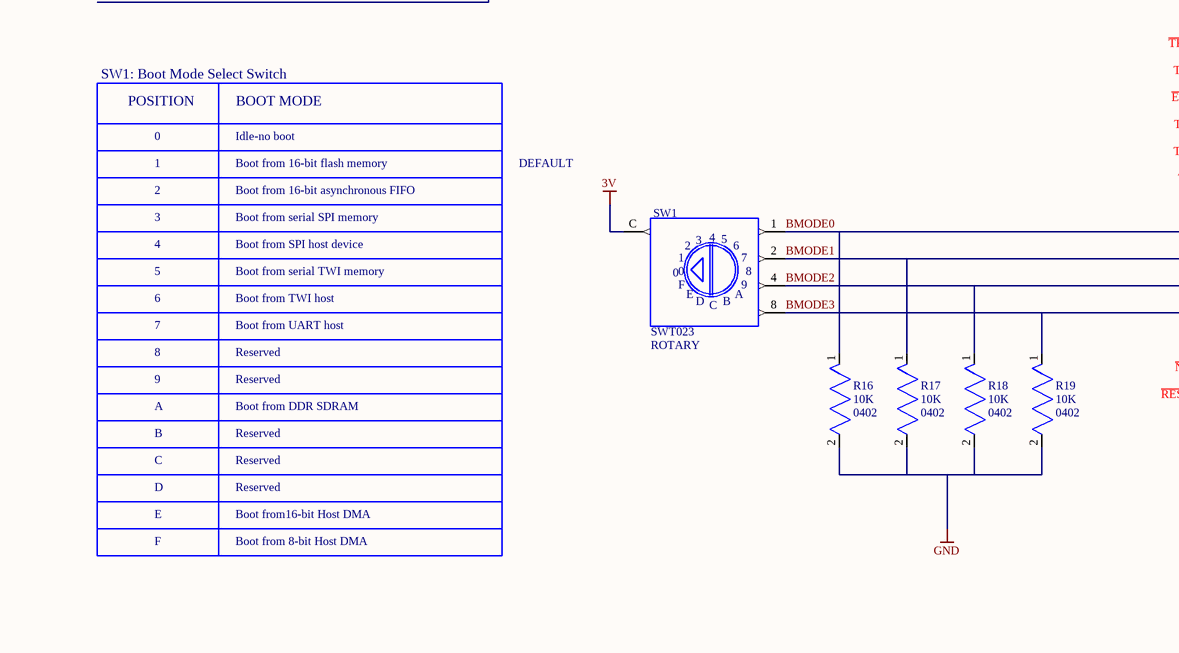
[diagram p9: a0206-2006.4.SchDoc, bottom left]
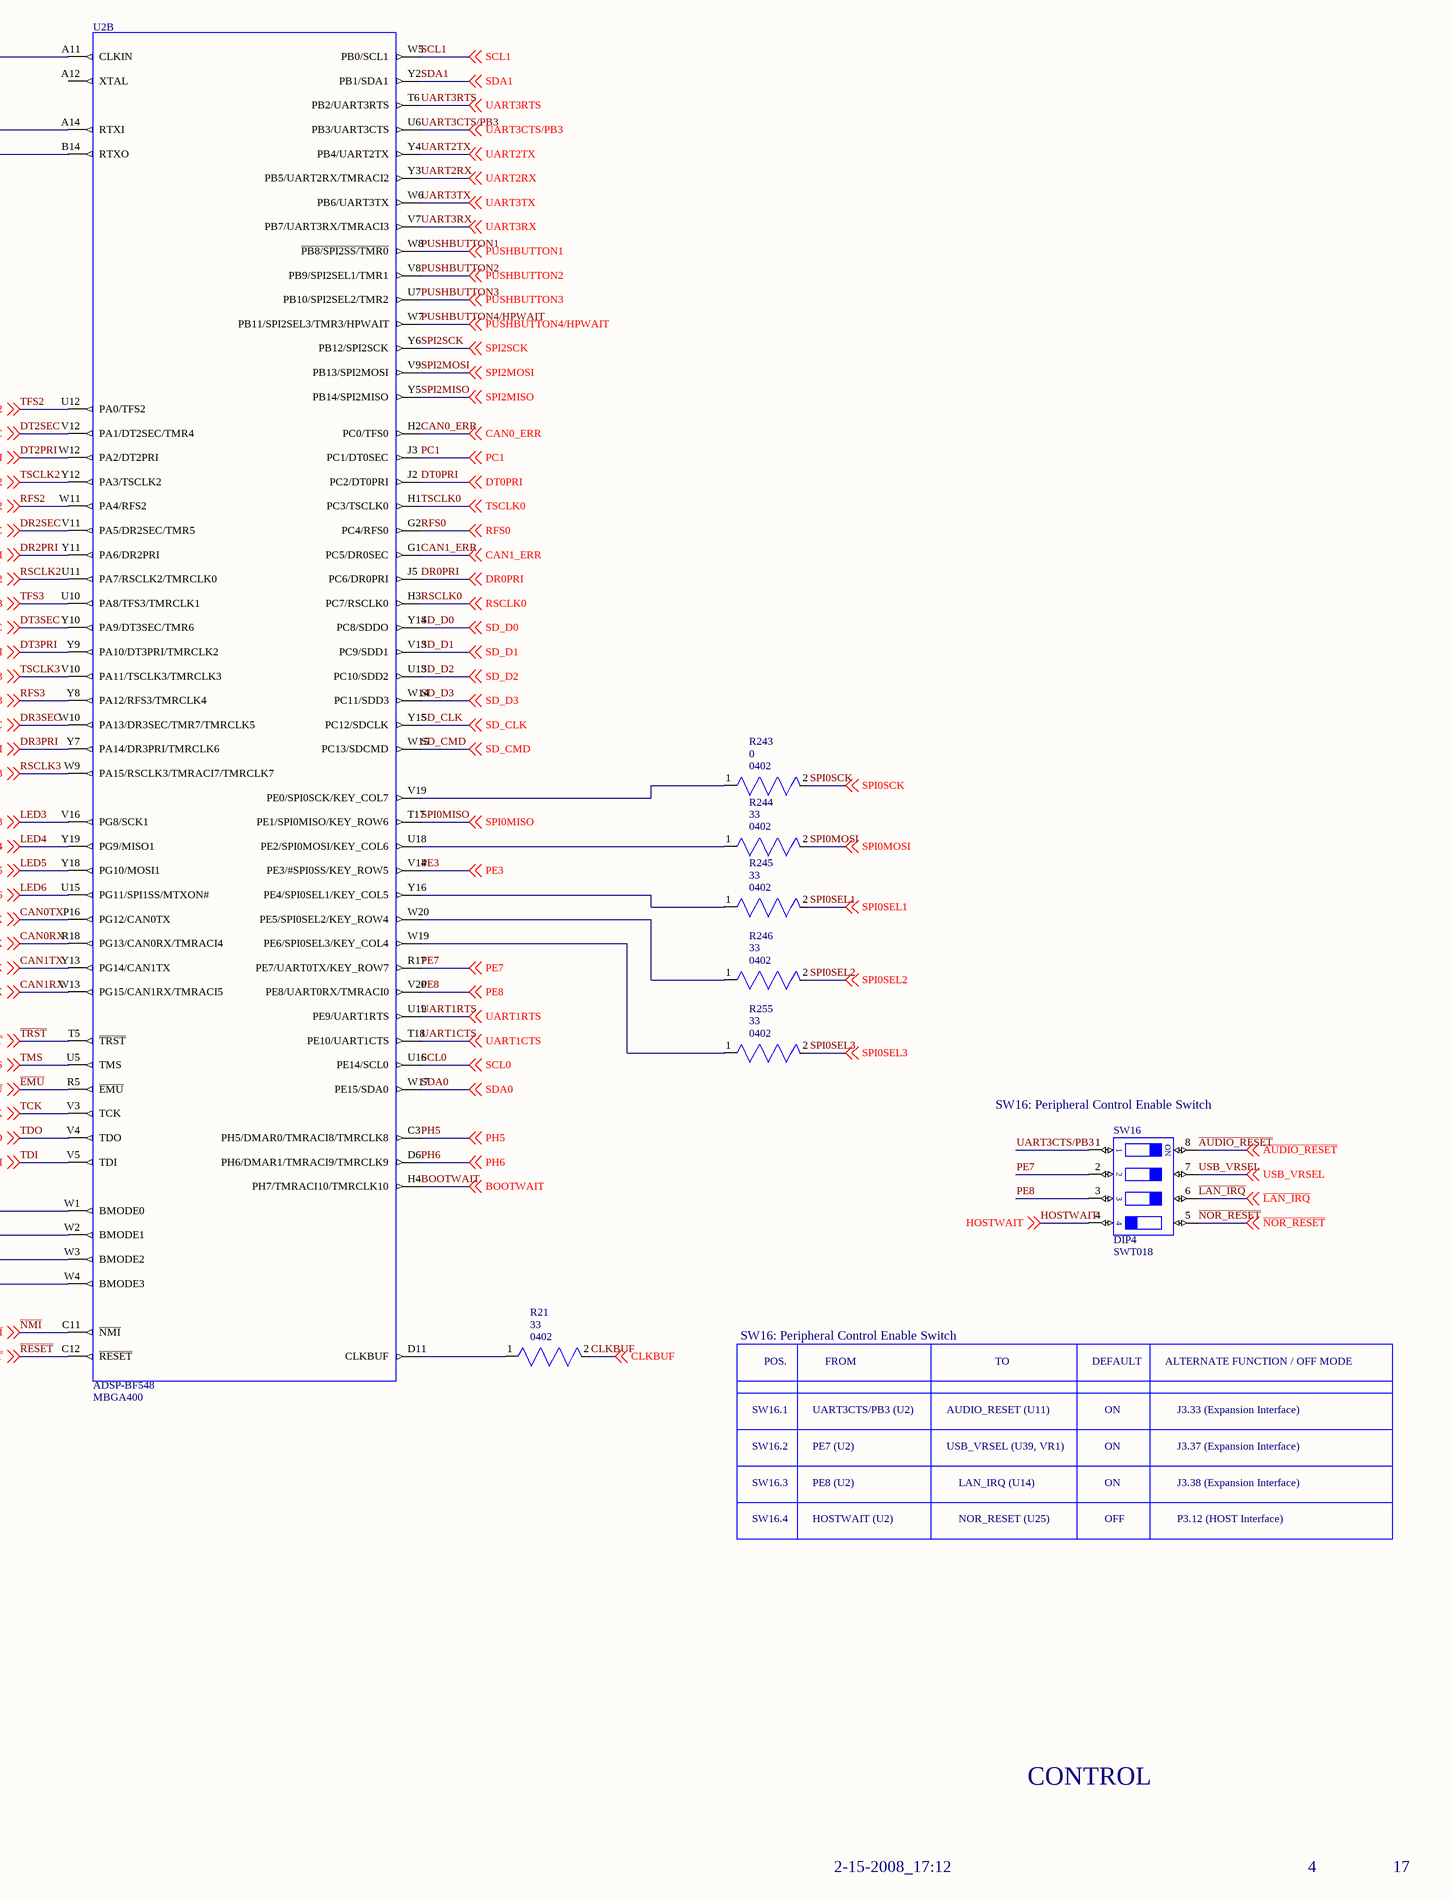
[diagram p10: a0206-2006.4.SchDoc, bottom right]

### Parts
C28  value 18PF  [0805]  (hidden comment: *)
C29  value 18PF  [0805]  (hidden comment: *)
C141  value 0.01UF  [0402]  (hidden comment: *)
R14  value 33  [0402]  (hidden comment: *)
R15  value 10M  [0603]  (hidden comment: *)
R16  value 10K  [0402]  (hidden comment: *)
R17  value 10K  [0402]  (hidden comment: *)
R18  value 10K  [0402]  (hidden comment: *)
R19  value 10K  [0402]  (hidden comment: *)
R21  value 33  [0402]  (hidden comment: *)
R139  value 1.2K  [0402]  (hidden comment: *)
R140  value 1.2K  [0402]  (hidden comment: *)
R171  value 10K  [0402]  (hidden comment: *)
R209  value 10K  [0402]  (hidden comment: *)
R230  value 10K  [0402]  (hidden comment: *)
R243  value 0  [0402]  (hidden comment: *)
R244  value 33  [0402]  (hidden comment: *)
R245  value 33  [0402]  (hidden comment: *)
R246  value 33  [0402]  (hidden comment: *)
R255  value 33  [0402]  (hidden comment: *)
R276  value 1.2K  [0402]  (hidden comment: *)
R277  value 1.2K  [0402]  (hidden comment: *)
SW1  value ROTARY  [SWT023]  (hidden comment: *)
SW16  value DIP4  [SWT018]  (hidden comment: *)
U2  PART: ADSP-BF548  PKG_TYPE: MBGA400  (hidden comment: ICS_ADSPBF548)  (part B of 7)
U7  value 25MHZ  [OSC003]  (hidden comment: *)
Y2  value 32.768KHZ  [OSC008]  (hidden comment: *)

### Nets
3V: C141.1(A) R139.1(N1) R140.1(N1) R171.1(N1) R209.1(N1) R230.1(N1) R276.1(N1) R277.1(N1) SW1.C U7.4(VDD)
GND: C28.2(B) C29.2(B) C141.2(B) R16.2(N2) R17.2(N2) R18.2(N2) R19.2(N2) U7.2(GND)
~{AUDIO_RESET}: SW16.8 ; off-sheet ~{AUDIO_RESET}
~{BR/PJ11}: R209.2(N2) ; off-sheet ~{BR/PJ11}
BMODE0: R16.1(N1) SW1.1(~{1}) U2.W1(BMODE0)
BMODE1: R17.1(N1) SW1.2(~{2}) U2.W2(BMODE1)
BMODE2: R18.1(N1) SW1.4(~{4}) U2.W3(BMODE2)
BMODE3: R19.1(N1) SW1.8(~{8}) U2.W4(BMODE3)
BOOTWAIT: U2.H4(PH7/TMRACI10/TMRCLK10) ; off-sheet BOOTWAIT
CAN0_ERR: U2.H2(PC0/TFS0) ; off-sheet CAN0_ERR
CAN0RX: U2.R18(PG13/CAN0RX/TMRACI4) ; off-sheet CAN0RX
CAN0TX: U2.P16(PG12/CAN0TX) ; off-sheet CAN0TX
CAN1_ERR: U2.G1(PC5/DR0SEC) ; off-sheet CAN1_ERR
CAN1RX: U2.W13(PG15/CAN1RX/TMRACI5) ; off-sheet CAN1RX
CAN1TX: U2.Y13(PG14/CAN1TX) ; off-sheet CAN1TX
CLKBUF: R21.2(N2) ; off-sheet CLKBUF
CLKIN: R14.2(N2) U2.A11(CLKIN)
DR0PRI: U2.J5(PC6/DR0PRI) ; off-sheet DR0PRI
DR2PRI: U2.Y11(PA6/DR2PRI) ; off-sheet DR2PRI
DR2SEC: U2.V11(PA5/DR2SEC/TMR5) ; off-sheet DR2SEC
DR3PRI: U2.Y7(PA14/DR3PRI/TMRCLK6) ; off-sheet DR3PRI
DR3SEC: U2.W10(PA13/DR3SEC/TMR7/TMRCLK5) ; off-sheet DR3SEC
DSP_OSC_RES: R14.1(N1) U7.3(OUT)
DT0PRI: U2.J2(PC2/DT0PRI) ; off-sheet DT0PRI
DT2PRI: U2.W12(PA2/DT2PRI) ; off-sheet DT2PRI
DT2SEC: U2.V12(PA1/DT2SEC/TMR4) ; off-sheet DT2SEC
DT3PRI: U2.Y9(PA10/DT3PRI/TMRCLK2) ; off-sheet DT3PRI
DT3SEC: U2.Y10(PA9/DT3SEC/TMR6) ; off-sheet DT3SEC
~{EMU}: U2.R5(~{EMU}) ; off-sheet ~{EMU}
HOSTWAIT: SW16.4 ; off-sheet HOSTWAIT
~{LAN_IRQ}: SW16.6 ; off-sheet ~{LAN_IRQ}
LED3: U2.V16(PG8/SCK1) ; off-sheet LED3
LED4: U2.Y19(PG9/MISO1) ; off-sheet LED4
LED5: U2.Y18(PG10/MOSI1) ; off-sheet LED5
LED6: U2.U15(PG11/SPI1SS/MTXON#) ; off-sheet LED6
~{NMI}: R171.2(N2) U2.C11(~{NMI}) ; off-sheet ~{NMI}
~{NOR_RESET}: SW16.5 ; off-sheet ~{NOR_RESET}
PC1: U2.J3(PC1/DT0SEC) ; off-sheet PC1
PE3: U2.V14(PE3/#SPI0SS/KEY_ROW5) ; off-sheet PE3
PE7: SW16.2 U2.R17(PE7/UART0TX/KEY_ROW7) ; off-sheet PE7
PE8: SW16.3 U2.V20(PE8/UART0RX/TMRACI0) ; off-sheet PE8
PH5: U2.C3(PH5/DMAR0/TMRACI8/TMRCLK8) ; off-sheet PH5
PH6: U2.D6(PH6/DMAR1/TMRACI9/TMRCLK9) ; off-sheet PH6
PUSHBUTTON1: U2.W8(~{PB8/SPI2SS/TMR0}) ; off-sheet PUSHBUTTON1
PUSHBUTTON2: U2.V8(PB9/SPI2SEL1/TMR1) ; off-sheet PUSHBUTTON2
PUSHBUTTON3: U2.U7(PB10/SPI2SEL2/TMR2) ; off-sheet PUSHBUTTON3
PUSHBUTTON4/HPWAIT: U2.W7(PB11/SPI2SEL3/TMR3/HPWAIT) ; off-sheet PUSHBUTTON4/HPWAIT
~{RESET}: U2.C12(~{RESET}) ; off-sheet ~{RESET}
RFS0: U2.G2(PC4/RFS0) ; off-sheet RFS0
RFS2: U2.W11(PA4/RFS2) ; off-sheet RFS2
RFS3: U2.Y8(PA12/RFS3/TMRCLK4) ; off-sheet RFS3
RSCLK0: U2.H3(PC7/RSCLK0) ; off-sheet RSCLK0
RSCLK2: U2.U11(PA7/RSCLK2/TMRCLK0) ; off-sheet RSCLK2
RSCLK3: U2.W9(PA15/RSCLK3/TMRACI7/TMRCLK7) ; off-sheet RSCLK3
RTXI: C28.1(A) R15.1(N1) U2.A14(RTXI) Y2.1(TERM1)
RTXO: C29.1(A) R15.2(N2) U2.B14(RTXO) Y2.4(TERM2)
SCL0: R139.2(N2) U2.U16(PE14/SCL0) ; off-sheet SCL0
SCL1: R277.2(N2) U2.W5(PB0/SCL1) ; off-sheet SCL1
SD_CLK: U2.Y15(PC12/SDCLK) ; off-sheet SD_CLK
SD_CMD: U2.W15(PC13/SDCMD) ; off-sheet SD_CMD
SD_D0: U2.Y14(PC8/SDDO) ; off-sheet SD_D0
SD_D1: U2.V13(PC9/SDD1) ; off-sheet SD_D1
SD_D2: U2.U13(PC10/SDD2) ; off-sheet SD_D2
SD_D3: U2.W14(PC11/SDD3) ; off-sheet SD_D3
SDA0: R140.2(N2) U2.W17(PE15/SDA0) ; off-sheet SDA0
SDA1: R276.2(N2) U2.Y2(PB1/SDA1) ; off-sheet SDA1
SPI0MISO: U2.T17(PE1/SPI0MISO/KEY_ROW6) ; off-sheet SPI0MISO
SPI0MOSI: R244.2(N2) ; off-sheet SPI0MOSI
SPI0SCK: R243.2(N2) ; off-sheet SPI0SCK
SPI0SEL1: R245.2(N2) ; off-sheet SPI0SEL1
SPI0SEL2: R246.2(N2) ; off-sheet SPI0SEL2
SPI0SEL3: R255.2(N2) ; off-sheet SPI0SEL3
SPI2MISO: U2.Y5(PB14/SPI2MISO) ; off-sheet SPI2MISO
SPI2MOSI: U2.V9(PB13/SPI2MOSI) ; off-sheet SPI2MOSI
SPI2SCK: U2.Y6(PB12/SPI2SCK) ; off-sheet SPI2SCK
~{TRST}: U2.T5(~{TRST}) ; off-sheet ~{TRST}
TCK: U2.V3(TCK) ; off-sheet TCK
TDI: U2.V5(TDI) ; off-sheet TDI
TDO: U2.V4(TDO) ; off-sheet TDO
TFS2: U2.U12(PA0/TFS2) ; off-sheet TFS2
TFS3: U2.U10(PA8/TFS3/TMRCLK1) ; off-sheet TFS3
TMS: U2.U5(TMS) ; off-sheet TMS
TSCLK0: U2.H1(PC3/TSCLK0) ; off-sheet TSCLK0
TSCLK2: U2.Y12(PA3/TSCLK2) ; off-sheet TSCLK2
TSCLK3: U2.V10(PA11/TSCLK3/TMRCLK3) ; off-sheet TSCLK3
UART1CTS: U2.T18(PE10/UART1CTS) ; off-sheet UART1CTS
UART1RTS: U2.U19(PE9/UART1RTS) ; off-sheet UART1RTS
UART2RX: U2.Y3(PB5/UART2RX/TMRACI2) ; off-sheet UART2RX
UART2TX: U2.Y4(PB4/UART2TX) ; off-sheet UART2TX
UART3CTS/PB3: SW16.1 U2.U6(PB3/UART3CTS) ; off-sheet UART3CTS/PB3
UART3RTS: U2.T6(PB2/UART3RTS) ; off-sheet UART3RTS
UART3RX: U2.V7(PB7/UART3RX/TMRACI3) ; off-sheet UART3RX
UART3TX: U2.W6(PB6/UART3TX) ; off-sheet UART3TX
USB_VRSEL: SW16.7 ; off-sheet USB_VRSEL
NetR21_1: R21.1(N1) U2.D11(CLKBUF)
NetR230_2: R230.2(N2) U7.1(OE)
NetR243_1: R243.1(N1) U2.V19(PE0/SPI0SCK/KEY_COL7)
NetR244_1: R244.1(N1) U2.U18(PE2/SPI0MOSI/KEY_COL6)
NetR245_1: R245.1(N1) U2.Y16(PE4/SPI0SEL1/KEY_COL5)
NetR246_1: R246.1(N1) U2.W20(PE5/SPI0SEL2/KEY_ROW4)
NetR255_1: R255.1(N1) U2.W19(PE6/SPI0SEL3/KEY_COL4)

Not connected (* = marked no-connect by the designer): SW1 3 5 6 7; U2 A12(XTAL); Y2 2(NC1) 3(NC2)

### Notes on the sheet
- U7
- RTC
- SW1: Boot Mode Select Switch
- POSITION
- BOOT MODE
- 1
- 0
- Idle-no boot
- Boot from 16-bit flash memory
- DEFAULT
- (near SW16) SW16: Peripheral Control Enable Switch
- 2
- 3
- 4
- Boot from 16-bit asynchronous FIFO
- Boot from serial SPI memory
- Boot from SPI host device
- 5
- 6
- Boot from serial TWI memory
- Boot from TWI host
- 7
- 8
- 9
- Reserved
- Boot from UART host
- SW16: Peripheral Control Enable Switch
- A
- B
- Boot from DDR SDRAM
- POS.
- FROM
- TO
- ALTERNATE FUNCTION / OFF MODE
- C
- D
- E
- Boot from16-bit Host DMA
- SW16.1
- SW16.2
- UART3CTS/PB3 (U2)
- PE7 (U2)
- AUDIO_RESET (U11)
- USB_VRSEL (U39, VR1)
- ON
- J3.33 (Expansion Interface)
- J3.37 (Expansion Interface)
- F
- Boot from 8-bit Host DMA
- SW16.3
- SW16.4
- PE8 (U2)
- HOSTWAIT (U2)
- LAN_IRQ (U14)
- NOR_RESET (U25)
- OFF
- J3.38 (Expansion Interface)
- P3.12 (HOST Interface)
- CONTROL
- 2-15-2008_17:12
- 17
- 20 Cotton Road
- DEVICES
- ANALOG
- Nashua, NH 03063
- PH: 1-800-ANALOGD
- Title
- ADSP-BF548 EZ-KIT LITE
- Size
- Board No.
- A0206-2006
- Rev
- 1.4B
- Date
- Sheet
- of
- (in symbol SW_DIP4.1) ON
- (in symbol SW_ROTARY_4.1) 0; F; 9; E; A; D; B

### Library data of the parts
C28 = CAP_NON_POLARIZED.2: PART_SPEC: CAPACITOR; LEVEL: STD; TYPE: NPO; BOARDS: BOTH; PRT_NUM: 7000287; TOLERANCE: 5%; VOLTAGE: 50V; PKG_TYPE: 0805; ROHS: ROHS
C29 = CAP_NON_POLARIZED.2: PART_SPEC: CAPACITOR; LEVEL: STD; TYPE: NPO; BOARDS: BOTH; PRT_NUM: 7000287; VOLTAGE: 50V; TOLERANCE: 5%; PKG_TYPE: 0805; ROHS: ROHS
C141 = CAP_NON_POLARIZED.2: as C7 on sheet a0206-2006.2; PKG_TYPE: 0402; ROHS: ROHS
R14 R21 = RES_STANDARD.1: PART_SPEC: RESISTOR; LEVEL: STD; POWER: 1/16W; BOARDS: BOTH; TOLERANCE: 5%; PRT_NUM: 7000285; PKG_TYPE: 0402; ROHS: ROHS
R15 = RES_STANDARD.1: PART_SPEC: RESISTOR; LEVEL: STD; POWER: 1/10W; PRT_NUM: 7000366; BOARDS: BOTH; TOLERANCE: 5%; PKG_TYPE: 0603; ROHS: ROHS
R16 R18 = RES_STANDARD.2: as R8 on sheet a0206-2006.3; PKG_TYPE: 0402; ROHS: ROHS
R17 R19 R230 = RES_STANDARD.2: as R9 on sheet a0206-2006.3; PKG_TYPE: 0402; ROHS: ROHS
R139 R276 = RES_STANDARD.2: PART_SPEC: RESISTOR; LEVEL: STD; BOARDS: BOTH; PRT_NUM: 7000283; TOLERANCE: 5%; POWER: 1/16W; PKG_TYPE: 0402; ROHS: ROHS
R140 R277 = RES_STANDARD.2: PART_SPEC: RESISTOR; LEVEL: STD; POWER: 1/16W; TOLERANCE: 5%; PRT_NUM: 7000283; BOARDS: BOTH; PKG_TYPE: 0402; ROHS: ROHS
R171 = RES_STANDARD.2: PART_SPEC: RESISTOR; LEVEL: STD; POWER: 1/16W; TOLERANCE: 5%; PRT_NUM: 7000280; BOARDS: BOTH; PKG_TYPE: 0402; ROHS: ROHS
R209 = RES_STANDARD.2: PART_SPEC: RESISTOR; LEVEL: STD; BOARDS: BOTH; PRT_NUM: 7000280; TOLERANCE: 5%; POWER: 1/16W; PKG_TYPE: 0402; ROHS: ROHS
R243 = RES_STANDARD.1: as R20 on sheet a0206-2006.3; PKG_TYPE: 0402; ROHS: ROHS
R244 R246 = RES_STANDARD.1: as R28 on sheet a0206-2006.2; PKG_TYPE: 0402; ROHS: ROHS
R245 R255 = RES_STANDARD.1: as R27 on sheet a0206-2006.2; PKG_TYPE: 0402; ROHS: ROHS
SW1 = SW_ROTARY_4.1: NC: 3,5,6,7; LEVEL: STD; PRT_NUM: 6000822; PKG_TYPE: SWT023; ROHS: ROHS
SW16 = SW_DIP4.1: as SW14 on sheet a0206-2006.3; PKG_TYPE: SWT018; ROHS: ROHS
U2 = ICS_ADSPBF548_A: as U2 on sheet a0206-2006.2; DEVICE: ICS_ADSPBF548; ROHS: ROHS; WEB: http://www.analog.com/en/prod/0,2877,ADSP%252DBF548,00.html
U7 = OSC_SMT_OE_POWER.1: OSCILLATOR; LEVEL: STD; PRT_NUM: 1000249; PART_SPEC: OSCILLATOR; PKG_TYPE: OSC003; ROHS: ROHS
Y2 = OSC_CRYSTAL_SMT.1: CRYSTAL; LEVEL: STD; BOARDS: BOTH; PRT_NUM: 1000225; VOLTAGE: SMT; PKG_TYPE: OSC008; ROHS: ROHS

## Sheet a0206-2006.5.SchDoc
size 558 x 431 mm
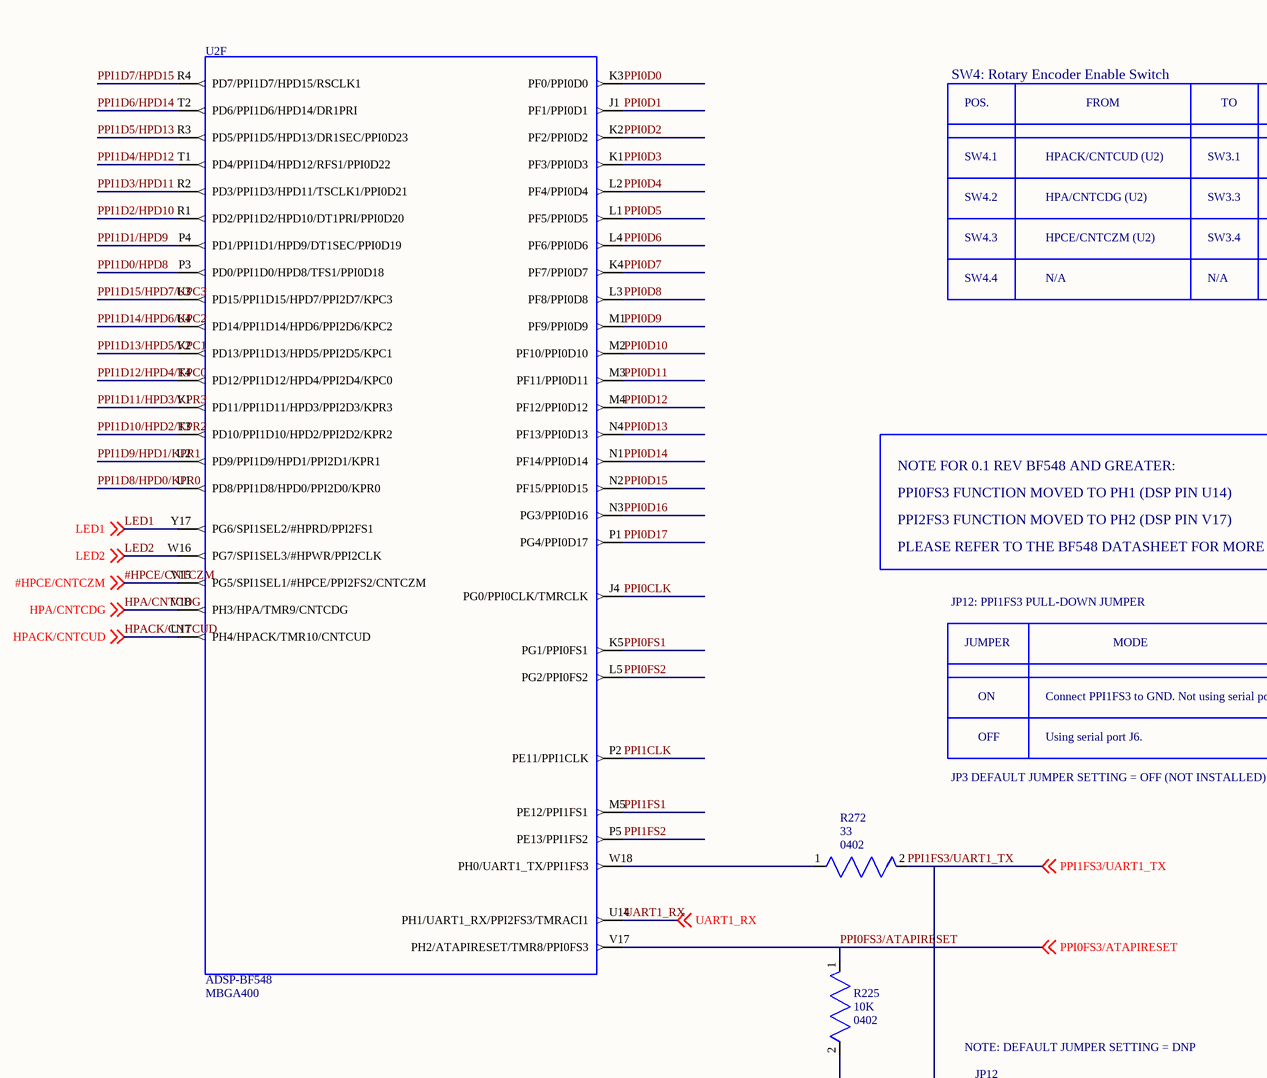
[diagram p11: a0206-2006.5.SchDoc, top left]
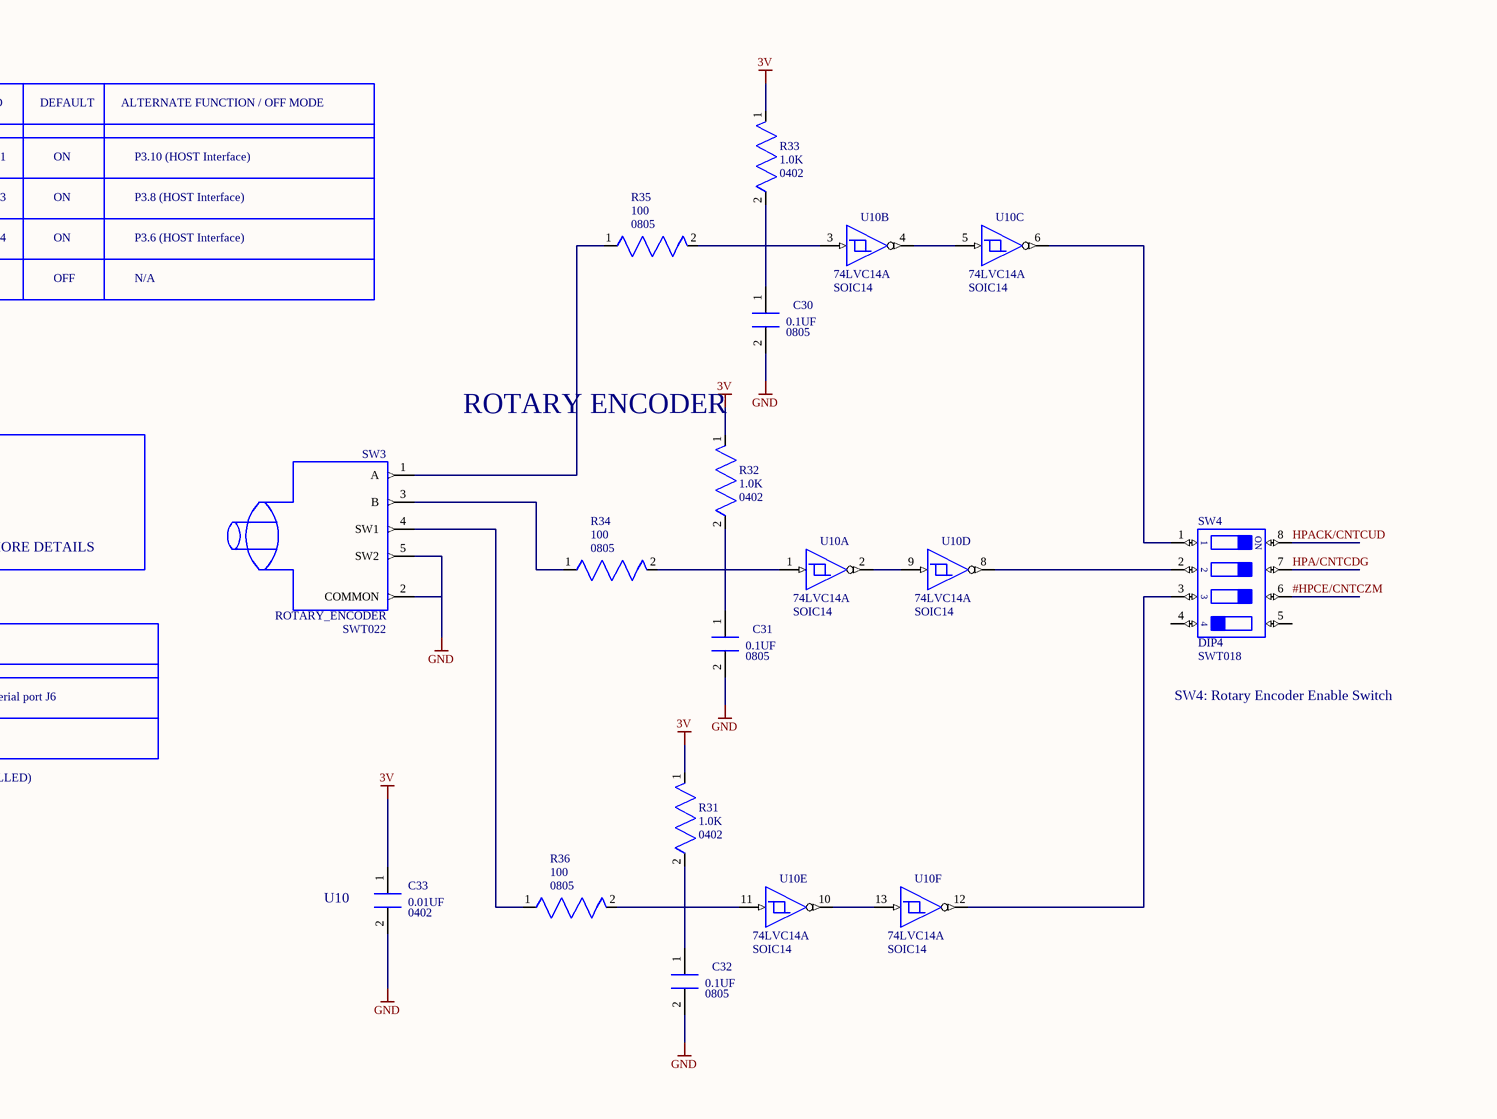
[diagram p12: a0206-2006.5.SchDoc, top right]
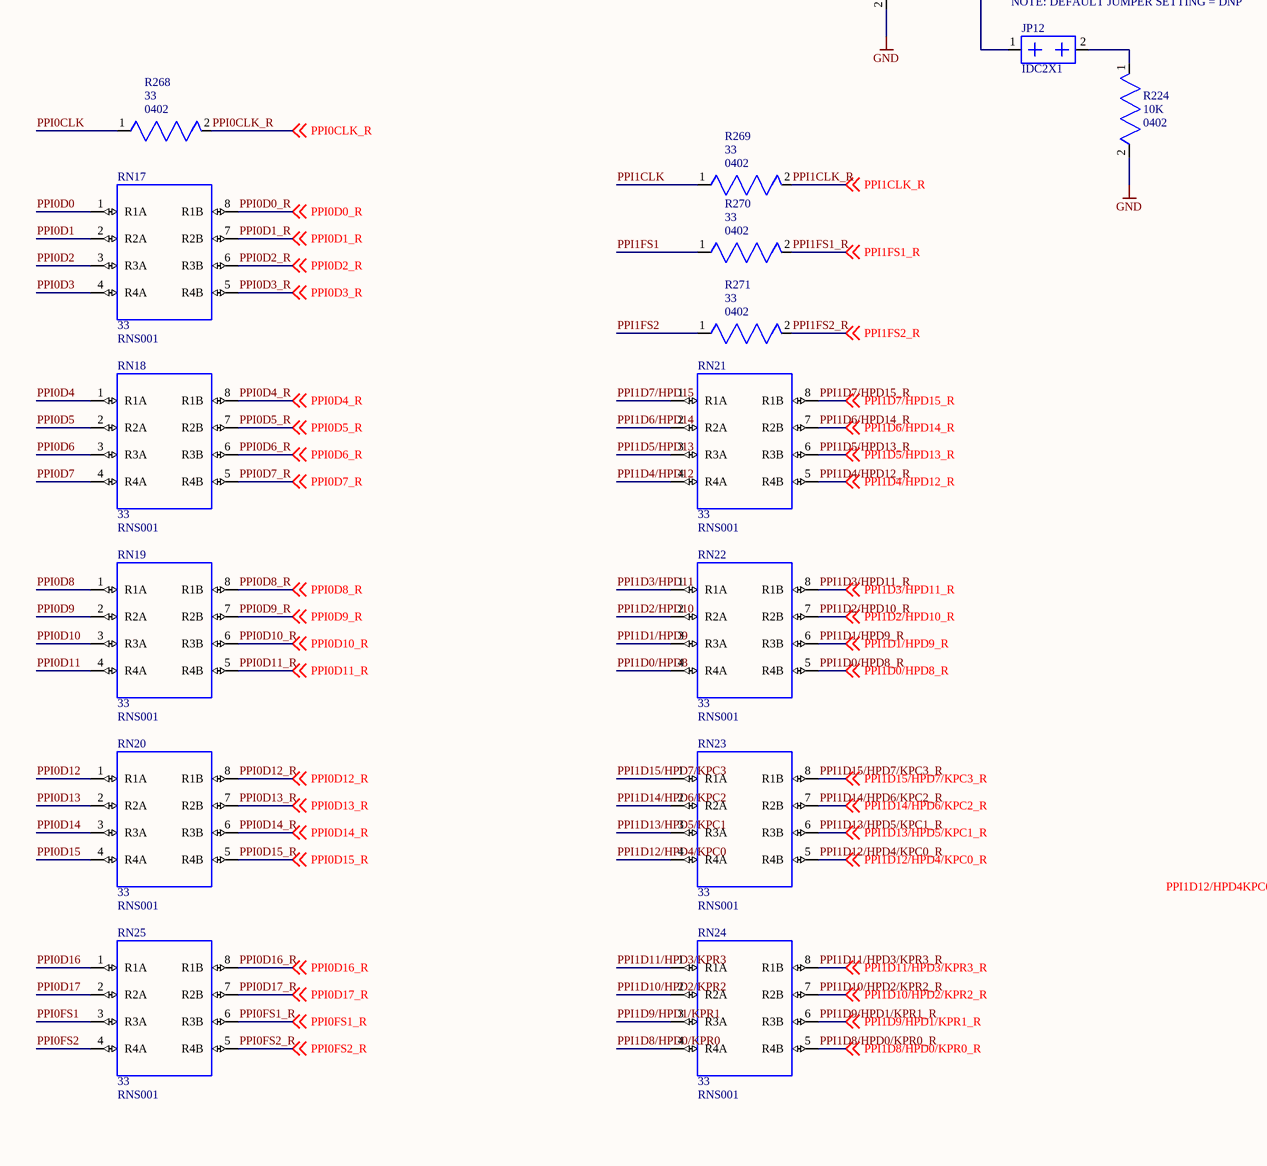
[diagram p13: a0206-2006.5.SchDoc, bottom left]
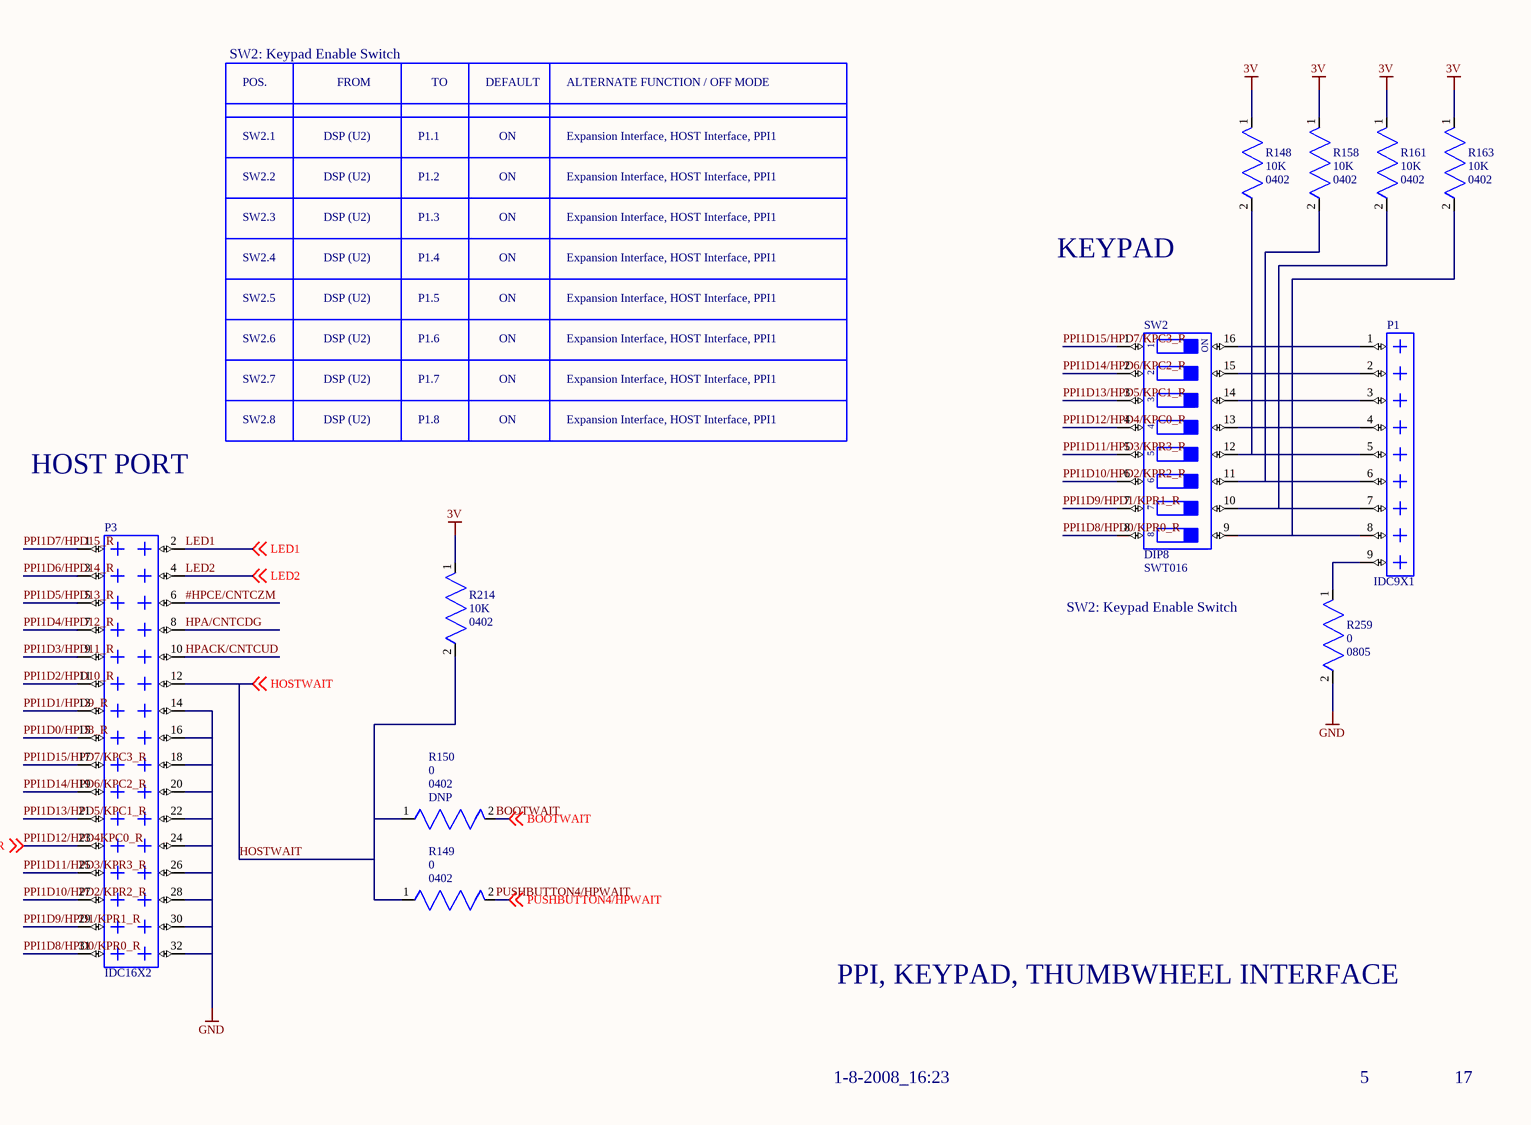
[diagram p14: a0206-2006.5.SchDoc, bottom right]

### Parts
C30  value 0.1UF  [0805]  (hidden comment: *)
C31  value 0.1UF  [0805]  (hidden comment: *)
C32  value 0.1UF  [0805]  (hidden comment: *)
C33  value 0.01UF  [0402]  (hidden comment: *)
JP12  *  [IDC2X1]  (value not drawn)
P1  *  [IDC9X1]  (value not drawn)
P3  *  [IDC16X2]  (value not drawn)
R31  value 1.0K  [0402]  (hidden comment: *)
R32  value 1.0K  [0402]  (hidden comment: *)
R33  value 1.0K  [0402]  (hidden comment: *)
R34  value 100  [0805]  (hidden comment: *)
R35  value 100  [0805]  (hidden comment: *)
R36  value 100  [0805]  (hidden comment: *)
R148  value 10K  [0402]  (hidden comment: *)
R149  value 0  [0402]  (hidden comment: *)
R150  value 0  CLASS: DNP  [0402]  (hidden comment: *)
R158  value 10K  [0402]  (hidden comment: *)
R161  value 10K  [0402]  (hidden comment: *)
R163  value 10K  [0402]  (hidden comment: *)
R214  value 10K  [0402]  (hidden comment: *)
R224  value 10K  [0402]  (hidden comment: *)
R225  value 10K  [0402]  (hidden comment: *)
R259  value 0  [0805]  (hidden comment: *)
R268  value 33  [0402]  (hidden comment: *)
R269  value 33  [0402]  (hidden comment: *)
R270  value 33  [0402]  (hidden comment: *)
R271  value 33  [0402]  (hidden comment: *)
R272  value 33  [0402]  (hidden comment: *)
RN17  value 33  [RNS001]  (hidden comment: *)
RN18  value 33  [RNS001]  (hidden comment: *)
RN19  value 33  [RNS001]  (hidden comment: *)
RN20  value 33  [RNS001]  (hidden comment: *)
RN21  value 33  [RNS001]  (hidden comment: *)
RN22  value 33  [RNS001]  (hidden comment: *)
RN23  value 33  [RNS001]  (hidden comment: *)
RN24  value 33  [RNS001]  (hidden comment: *)
RN25  value 33  [RNS001]  (hidden comment: *)
SW2  value DIP8  [SWT016]  (hidden comment: *)
SW3  value ROTARY_ENCODER  [SWT022]  (hidden comment: *)
SW4  value DIP4  [SWT018]  (hidden comment: *)
U2  PART: ADSP-BF548  PKG_TYPE: MBGA400  (hidden comment: ICS_ADSPBF548)  (part F of 7)
U10  PART: 74LVC14A  [SOIC14]  (hidden comment: *)  (parts A,B,C,D,E,F of 6)

### Nets
3V: C33.1(A) R31.1(N1) R32.1(N1) R33.1(N1) R148.1(N1) R158.1(N1) R161.1(N1) R163.1(N1) R214.1(N1) U10.14(3V)
GND: C30.2(B) C31.2(B) C32.2(B) C33.2(B) P3.14 P3.16 P3.18 P3.20 P3.22 P3.24 P3.26 P3.28 P3.30 P3.32 R224.2(N2) R225.2(N2) R259.2(N2) SW3.2(COMMON) SW3.5(SW2) U10.7(GND)
#HPCE/CNTCZM: P3.6 SW4.6 U2.V15(PG5/SPI1SEL1/#HPCE/PPI2FS2/CNTCZM) ; off-sheet #HPCE/CNTCZM
BOOTWAIT: R150.2(N2) ; off-sheet BOOTWAIT
HOSTWAIT: P3.12 R149.1(N1) R150.1(N1) R214.2(N2) ; off-sheet HOSTWAIT
HPA/CNTCDG: P3.8 SW4.7 U2.V18(PH3/HPA/TMR9/CNTCDG) ; off-sheet HPA/CNTCDG
HPACK/CNTCUD: P3.10 SW4.8 U2.U17(PH4/HPACK/TMR10/CNTCUD) ; off-sheet HPACK/CNTCUD
LED1: P3.2 U2.Y17(PG6/SPI1SEL2/#HPRD/PPI2FS1) ; off-sheet LED1
LED2: P3.4 U2.W16(PG7/SPI1SEL3/#HPWR/PPI2CLK) ; off-sheet LED2
PPI0CLK: R268.1(N1) U2.J4(PG0/PPI0CLK/TMRCLK)
PPI0CLK_R: R268.2(N2) ; off-sheet PPI0CLK_R
PPI0D0: RN17.1(R1A) U2.K3(PF0/PPI0D0)
PPI0D0_R: RN17.8(R1B) ; off-sheet PPI0D0_R
PPI0D1: RN17.2(R2A) U2.J1(PF1/PPI0D1)
PPI0D1_R: RN17.7(R2B) ; off-sheet PPI0D1_R
PPI0D2: RN17.3(R3A) U2.K2(PF2/PPI0D2)
PPI0D2_R: RN17.6(R3B) ; off-sheet PPI0D2_R
PPI0D3: RN17.4(R4A) U2.K1(PF3/PPI0D3)
PPI0D3_R: RN17.5(R4B) ; off-sheet PPI0D3_R
PPI0D4: RN18.1(R1A) U2.L2(PF4/PPI0D4)
PPI0D4_R: RN18.8(R1B) ; off-sheet PPI0D4_R
PPI0D5: RN18.2(R2A) U2.L1(PF5/PPI0D5)
PPI0D5_R: RN18.7(R2B) ; off-sheet PPI0D5_R
PPI0D6: RN18.3(R3A) U2.L4(PF6/PPI0D6)
PPI0D6_R: RN18.6(R3B) ; off-sheet PPI0D6_R
PPI0D7: RN18.4(R4A) U2.K4(PF7/PPI0D7)
PPI0D7_R: RN18.5(R4B) ; off-sheet PPI0D7_R
PPI0D8: RN19.1(R1A) U2.L3(PF8/PPI0D8)
PPI0D8_R: RN19.8(R1B) ; off-sheet PPI0D8_R
PPI0D9: RN19.2(R2A) U2.M1(PF9/PPI0D9)
PPI0D9_R: RN19.7(R2B) ; off-sheet PPI0D9_R
PPI0D10: RN19.3(R3A) U2.M2(PF10/PPI0D10)
PPI0D10_R: RN19.6(R3B) ; off-sheet PPI0D10_R
PPI0D11: RN19.4(R4A) U2.M3(PF11/PPI0D11)
PPI0D11_R: RN19.5(R4B) ; off-sheet PPI0D11_R
PPI0D12: RN20.1(R1A) U2.M4(PF12/PPI0D12)
PPI0D12_R: RN20.8(R1B) ; off-sheet PPI0D12_R
PPI0D13: RN20.2(R2A) U2.N4(PF13/PPI0D13)
PPI0D13_R: RN20.7(R2B) ; off-sheet PPI0D13_R
PPI0D14: RN20.3(R3A) U2.N1(PF14/PPI0D14)
PPI0D14_R: RN20.6(R3B) ; off-sheet PPI0D14_R
PPI0D15: RN20.4(R4A) U2.N2(PF15/PPI0D15)
PPI0D15_R: RN20.5(R4B) ; off-sheet PPI0D15_R
PPI0D16: RN25.1(R1A) U2.N3(PG3/PPI0D16)
PPI0D16_R: RN25.8(R1B) ; off-sheet PPI0D16_R
PPI0D17: RN25.2(R2A) U2.P1(PG4/PPI0D17)
PPI0D17_R: RN25.7(R2B) ; off-sheet PPI0D17_R
PPI0FS1: RN25.3(R3A) U2.K5(PG1/PPI0FS1)
PPI0FS1_R: RN25.6(R3B) ; off-sheet PPI0FS1_R
PPI0FS2: RN25.4(R4A) U2.L5(PG2/PPI0FS2)
PPI0FS2_R: RN25.5(R4B) ; off-sheet PPI0FS2_R
PPI0FS3/ATAPIRESET: R225.1(N1) U2.V17(PH2/ATAPIRESET/TMR8/PPI0FS3) ; off-sheet PPI0FS3/ATAPIRESET
PPI1CLK: R269.1(N1) U2.P2(PE11/PPI1CLK)
PPI1CLK_R: R269.2(N2) ; off-sheet PPI1CLK_R
PPI1D0/HPD8: RN22.4(R4A) U2.P3(PD0/PPI1D0/HPD8/TFS1/PPI0D18)
PPI1D0/HPD8_R: P3.15 RN22.5(R4B) ; off-sheet PPI1D0/HPD8_R
PPI1D1/HPD9: RN22.3(R3A) U2.P4(PD1/PPI1D1/HPD9/DT1SEC/PPI0D19)
PPI1D1/HPD9_R: P3.13 RN22.6(R3B) ; off-sheet PPI1D1/HPD9_R
PPI1D2/HPD10: RN22.2(R2A) U2.R1(PD2/PPI1D2/HPD10/DT1PRI/PPI0D20)
PPI1D2/HPD10_R: P3.11 RN22.7(R2B) ; off-sheet PPI1D2/HPD10_R
PPI1D3/HPD11: RN22.1(R1A) U2.R2(PD3/PPI1D3/HPD11/TSCLK1/PPI0D21)
PPI1D3/HPD11_R: P3.9 RN22.8(R1B) ; off-sheet PPI1D3/HPD11_R
PPI1D4/HPD12: RN21.4(R4A) U2.T1(PD4/PPI1D4/HPD12/RFS1/PPI0D22)
PPI1D4/HPD12_R: P3.7 RN21.5(R4B) ; off-sheet PPI1D4/HPD12_R
PPI1D5/HPD13: RN21.3(R3A) U2.R3(PD5/PPI1D5/HPD13/DR1SEC/PPI0D23)
PPI1D5/HPD13_R: P3.5 RN21.6(R3B) ; off-sheet PPI1D5/HPD13_R
PPI1D6/HPD14: RN21.2(R2A) U2.T2(PD6/PPI1D6/HPD14/DR1PRI)
PPI1D6/HPD14_R: P3.3 RN21.7(R2B) ; off-sheet PPI1D6/HPD14_R
PPI1D7/HPD15: RN21.1(R1A) U2.R4(PD7/PPI1D7/HPD15/RSCLK1)
PPI1D7/HPD15_R: P3.1 RN21.8(R1B) ; off-sheet PPI1D7/HPD15_R
PPI1D8/HPD0/KPR0: RN24.4(R4A) U2.U1(PD8/PPI1D8/HPD0/PPI2D0/KPR0)
PPI1D8/HPD0/KPR0_R: P3.31 RN24.5(R4B) SW2.8 ; off-sheet PPI1D8/HPD0/KPR0_R
PPI1D9/HPD1/KPR1: RN24.3(R3A) U2.U2(PD9/PPI1D9/HPD1/PPI2D1/KPR1)
PPI1D9/HPD1/KPR1_R: P3.29 RN24.6(R3B) SW2.7 ; off-sheet PPI1D9/HPD1/KPR1_R
PPI1D10/HPD2/KPR2: RN24.2(R2A) U2.T3(PD10/PPI1D10/HPD2/PPI2D2/KPR2)
PPI1D10/HPD2/KPR2_R: P3.27 RN24.7(R2B) SW2.6 ; off-sheet PPI1D10/HPD2/KPR2_R
PPI1D11/HPD3/KPR3: RN24.1(R1A) U2.V1(PD11/PPI1D11/HPD3/PPI2D3/KPR3)
PPI1D11/HPD3/KPR3_R: P3.25 RN24.8(R1B) SW2.5 ; off-sheet PPI1D11/HPD3/KPR3_R
PPI1D12/HPD4/KPC0: RN23.4(R4A) U2.T4(PD12/PPI1D12/HPD4/PPI2D4/KPC0)
PPI1D12/HPD4/KPC0_R: RN23.5(R4B) SW2.4 ; off-sheet PPI1D12/HPD4/KPC0_R
PPI1D12/HPD4KPC0_R: P3.23 ; off-sheet PPI1D12/HPD4KPC0_R
PPI1D13/HPD5/KPC1: RN23.3(R3A) U2.V2(PD13/PPI1D13/HPD5/PPI2D5/KPC1)
PPI1D13/HPD5/KPC1_R: P3.21 RN23.6(R3B) SW2.3 ; off-sheet PPI1D13/HPD5/KPC1_R
PPI1D14/HPD6/KPC2: RN23.2(R2A) U2.U4(PD14/PPI1D14/HPD6/PPI2D6/KPC2)
PPI1D14/HPD6/KPC2_R: P3.19 RN23.7(R2B) SW2.2 ; off-sheet PPI1D14/HPD6/KPC2_R
PPI1D15/HPD7/KPC3: RN23.1(R1A) U2.U3(PD15/PPI1D15/HPD7/PPI2D7/KPC3)
PPI1D15/HPD7/KPC3_R: P3.17 RN23.8(R1B) SW2.1 ; off-sheet PPI1D15/HPD7/KPC3_R
PPI1FS1: R270.1(N1) U2.M5(PE12/PPI1FS1)
PPI1FS1_R: R270.2(N2) ; off-sheet PPI1FS1_R
PPI1FS2: R271.1(N1) U2.P5(PE13/PPI1FS2)
PPI1FS2_R: R271.2(N2) ; off-sheet PPI1FS2_R
PPI1FS3/UART1_TX: JP12.1 R272.2(N2) ; off-sheet PPI1FS3/UART1_TX
PUSHBUTTON4/HPWAIT: R149.2(N2) ; off-sheet PUSHBUTTON4/HPWAIT
UART1_RX: U2.U14(PH1/UART1_RX/PPI2FS3/TMRACI1) ; off-sheet UART1_RX
NetC30_1: C30.1(A) R33.2(N2) R35.2(N2) U10.3(A)
NetC31_1: C31.1(A) R32.2(N2) R34.2(N2) U10.1(A)
NetC32_1: C32.1(A) R31.2(N2) R36.2(N2) U10.11(A)
NetJP12_2: JP12.2 R224.1(N1)
NetP1_1: P1.1 SW2.16
NetP1_2: P1.2 SW2.15
NetP1_3: P1.3 SW2.14
NetP1_4: P1.4 SW2.13
NetP1_5: P1.5 R148.2(N2) SW2.12
NetP1_6: P1.6 R158.2(N2) SW2.11
NetP1_7: P1.7 R161.2(N2) SW2.10
NetP1_8: P1.8 R163.2(N2) SW2.9
NetP1_9: P1.9 R259.1(N1)
NetR34_1: R34.1(N1) SW3.3(B)
NetR35_1: R35.1(N1) SW3.1(A)
NetR36_1: R36.1(N1) SW3.4(SW1)
NetR272_1: R272.1(N1) U2.W18(PH0/UART1_TX/PPI1FS3)
NetSW4_1: SW4.1 U10.6(Y)
NetSW4_2: SW4.2 U10.8(Y)
NetSW4_3: SW4.3 U10.12(Y)
NetU10_2: U10.2(Y) U10.9(A)
NetU10_4: U10.4(Y) U10.5(A)
NetU10_10: U10.10(Y) U10.13(A)

Not connected (* = marked no-connect by the designer): SW4 4 5

### Notes on the sheet
- SW4: Rotary Encoder Enable Switch
- SW4.1
- POS.
- HPACK/CNTCUD (U2)
- FROM
- SW3.1
- TO
- DEFAULT
- ON
- ALTERNATE FUNCTION / OFF MODE
- P3.10 (HOST Interface)
- SW4.2
- HPA/CNTCDG (U2)
- SW3.3
- P3.8 (HOST Interface)
- SW4.3
- SW4.4
- N/A
- HPCE/CNTCZM (U2)
- SW3.4
- OFF
- P3.6 (HOST Interface)
- ROTARY ENCODER
- PPI0FS3 FUNCTION MOVED TO PH1 (DSP PIN U14)
- NOTE FOR 0.1 REV BF548 AND GREATER:
- PPI2FS3 FUNCTION MOVED TO PH2 (DSP PIN V17)
- PLEASE REFER TO THE BF548 DATASHEET FOR MORE DETAILS
- JP12: PPI1FS3 PULL-DOWN JUMPER
- JUMPER
- Connect PPI1FS3 to GND. Not using serial port J6
- MODE
- Using serial port J6.
- JP3 DEFAULT JUMPER SETTING = OFF (NOT INSTALLED)
- (near C33) U10
- NOTE: DEFAULT JUMPER SETTING = DNP
- SW2: Keypad Enable Switch
- SW2.1
- DSP (U2)
- P1.1
- Expansion Interface, HOST Interface, PPI1
- SW2.2
- SW2.3
- P1.2
- P1.3
- SW2.4
- P1.4
- KEYPAD
- SW2.5
- SW2.6
- P1.5
- P1.6
- SW2.7
- SW2.8
- P1.7
- P1.8
- HOST PORT
- PPI, KEYPAD, THUMBWHEEL INTERFACE
- 1-8-2008_16:23
- 5
- 17
- A
- B
- C
- D
- 1
- 2
- 3
- 20 Cotton Road
- 4
- DEVICES
- ANALOG
- Nashua, NH 03063
- PH: 1-800-ANALOGD
- Title
- ADSP-BF548 EZ-KIT LITE
- Size
- Board No.
- A0206-2006
- Rev
- 1.4B
- Date
- Sheet
- of
- (in symbol SW_DIP4.1) ON
- (in symbol SW_DIP8.1) ON

### Library data of the parts
C30 C32 = CAP_NON_POLARIZED.2: PART_SPEC: CAPACITOR; LEVEL: STD; TYPE: X7R; TOLERANCE: 10%; VOLTAGE: 50V; PRT_NUM: 7000034; BOARDS: BOTH; PKG_TYPE: 0805; ROHS: ROHS
C31 = CAP_NON_POLARIZED.2: PART_SPEC: CAPACITOR; LEVEL: STD; TYPE: X7R; PRT_NUM: 7000034; VOLTAGE: 50V; TOLERANCE: 10%; BOARDS: BOTH; PKG_TYPE: 0805; ROHS: ROHS
C33 = CAP_NON_POLARIZED.2: as C5 on sheet a0206-2006.2; PKG_TYPE: 0402; ROHS: ROHS
JP12 = CON_JP_2X1.2: HEADER; PART_SPEC: CONNECTOR; LEVEL: STD; PRT_NUM: 6000774; CONFIGURATION: 2X1; PKG_TYPE: IDC2X1; TYPE: IDC; ROHS: ROHS
P1 = CON_9X1.1: SOCKET; PART_SPEC: CONNECTOR; LEVEL: STD; CONFIGURATION: 9X1; PRT_NUM: 6000839; PKG_TYPE: IDC9X1; ROHS: ROHS; TYPE: IDC
P3 = CON_16X2.1: HEADER; PART_SPEC: CONNECTOR; LEVEL: STD; PRT_NUM: 6000827; CONFIGURATION: 16X2; PKG_TYPE: IDC16X2; TYPE: IDC; ROHS: ROHS
R31-R33 = RES_STANDARD.2: PART_SPEC: RESISTOR; LEVEL: STD; POWER: 1/16W; BOARDS: BOTH; TOLERANCE: 1%; PRT_NUM: 7000571; PKG_TYPE: 0402; ROHS: ROHS
R34 = RES_STANDARD.1: PART_SPEC: RESISTOR; LEVEL: STD; POWER: 1/10W; BOARDS: BOTH; TOLERANCE: 5%; PRT_NUM: 7000097; PKG_TYPE: 0805; ROHS: ROHS
R35 R36 = RES_STANDARD.1: PART_SPEC: RESISTOR; LEVEL: STD; POWER: 1/10W; BOARDS: BOTH; PRT_NUM: 7000097; TOLERANCE: 5%; PKG_TYPE: 0805; ROHS: ROHS
R148 R161 R224 = RES_STANDARD.2: as R8 on sheet a0206-2006.3; PKG_TYPE: 0402; ROHS: ROHS
R149 = RES_STANDARD.1: as R20 on sheet a0206-2006.3; PKG_TYPE: 0402; ROHS: ROHS
R150 = RES_STANDARD.1: as R205 on sheet a0206-2006.3; PKG_TYPE: 0402; ROHS: ROHS
R158 R163 R214 R225 = RES_STANDARD.2: as R9 on sheet a0206-2006.3; PKG_TYPE: 0402; ROHS: ROHS
R259 = RES_STANDARD.2: PART_SPEC: RESISTOR; LEVEL: STD; TOLERANCE: 5%; POWER: 1/10W; PRT_NUM: 7000228; PKG_TYPE: 0805; ROHS: ROHS
R268 R270 R272 = RES_STANDARD.1: as R27 on sheet a0206-2006.2; PKG_TYPE: 0402; ROHS: ROHS
R269 R271 = RES_STANDARD.1: as R28 on sheet a0206-2006.2; PKG_TYPE: 0402; ROHS: ROHS
RN17 RN19 RN22 RN24 = RNET_4SERIES.1: as RN1 on sheet a0206-2006.2; PKG_TYPE: RNS001; ROHS: ROHS
RN18 RN20 RN21 RN23 RN25 = RNET_4SERIES.1: as RN2 on sheet a0206-2006.2; PKG_TYPE: RNS001; ROHS: ROHS
SW2 = SW_DIP8.1: PART_SPEC: SWITCH; LEVEL: STD; PRT_NUM: 6000128; PKG_TYPE: SWT016; ROHS: ROHS
SW3 = SW_THUMBWHEEL.1: LEVEL: STD; PRT_NUM: 6000823; PKG_TYPE: SWT022; ROHS: ROHS
SW4 = SW_DIP4.1: as SW14 on sheet a0206-2006.3; PKG_TYPE: SWT018; ROHS: ROHS
U2 = ICS_ADSPBF548_A: as U2 on sheet a0206-2006.2; DEVICE: ICS_ADSPBF548; ROHS: ROHS; WEB: http://www.analog.com/en/prod/0,2877,ADSP%252DBF548,00.html
U10 = ICS_SN74XXX14.1: HEX-INVER-SCHMITT-TRIGGER; LEVEL: STD; BOARDS: BOTH; PRT_NUM: 1000097; PKG_TYPE: SOIC14; WEB: http://focus.ti.com/docs/prod/folders/print/sn74lvc14a.html; ROHS: ROHS